# EAGLE schematic 6502_nes_book (EAGLE 6.4), part 3 of 5
## Sheet 14 of 29
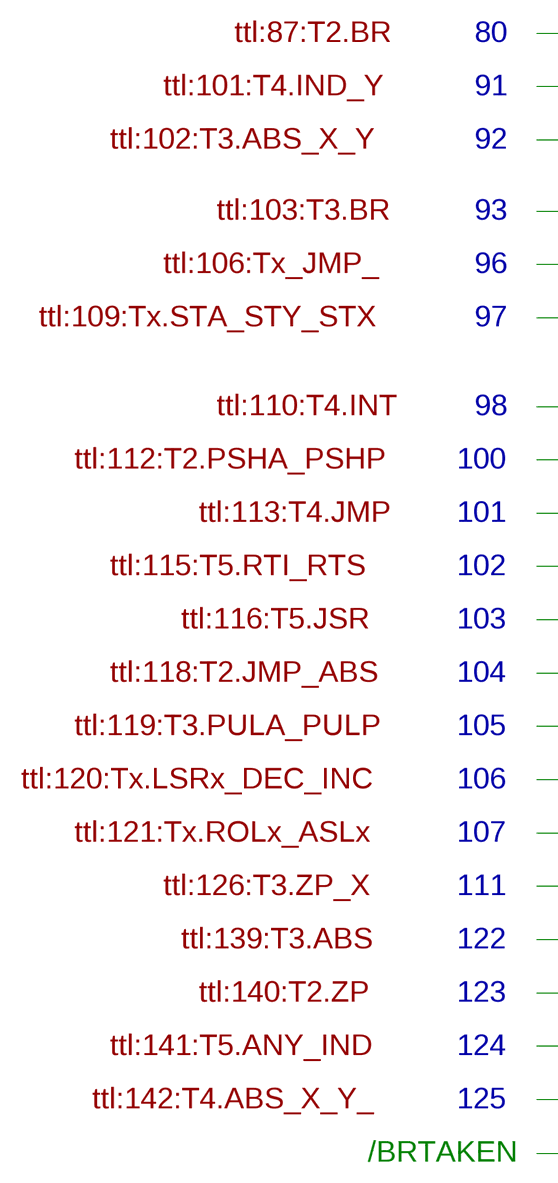
[diagram p15: schematic, sheet 14, part 1 of 3]
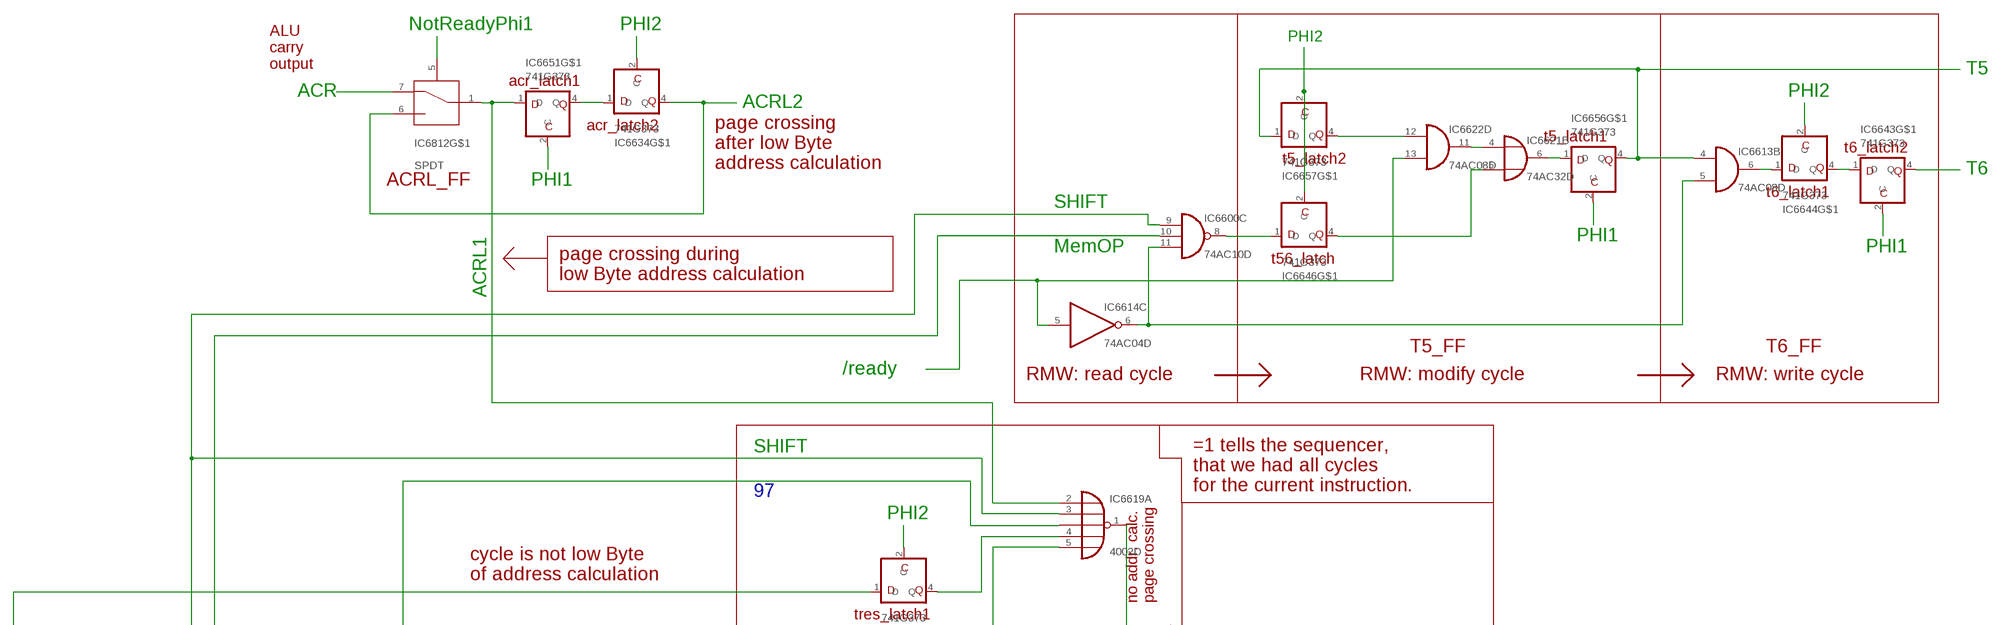
[diagram p16: schematic, sheet 14, part 2 of 3]
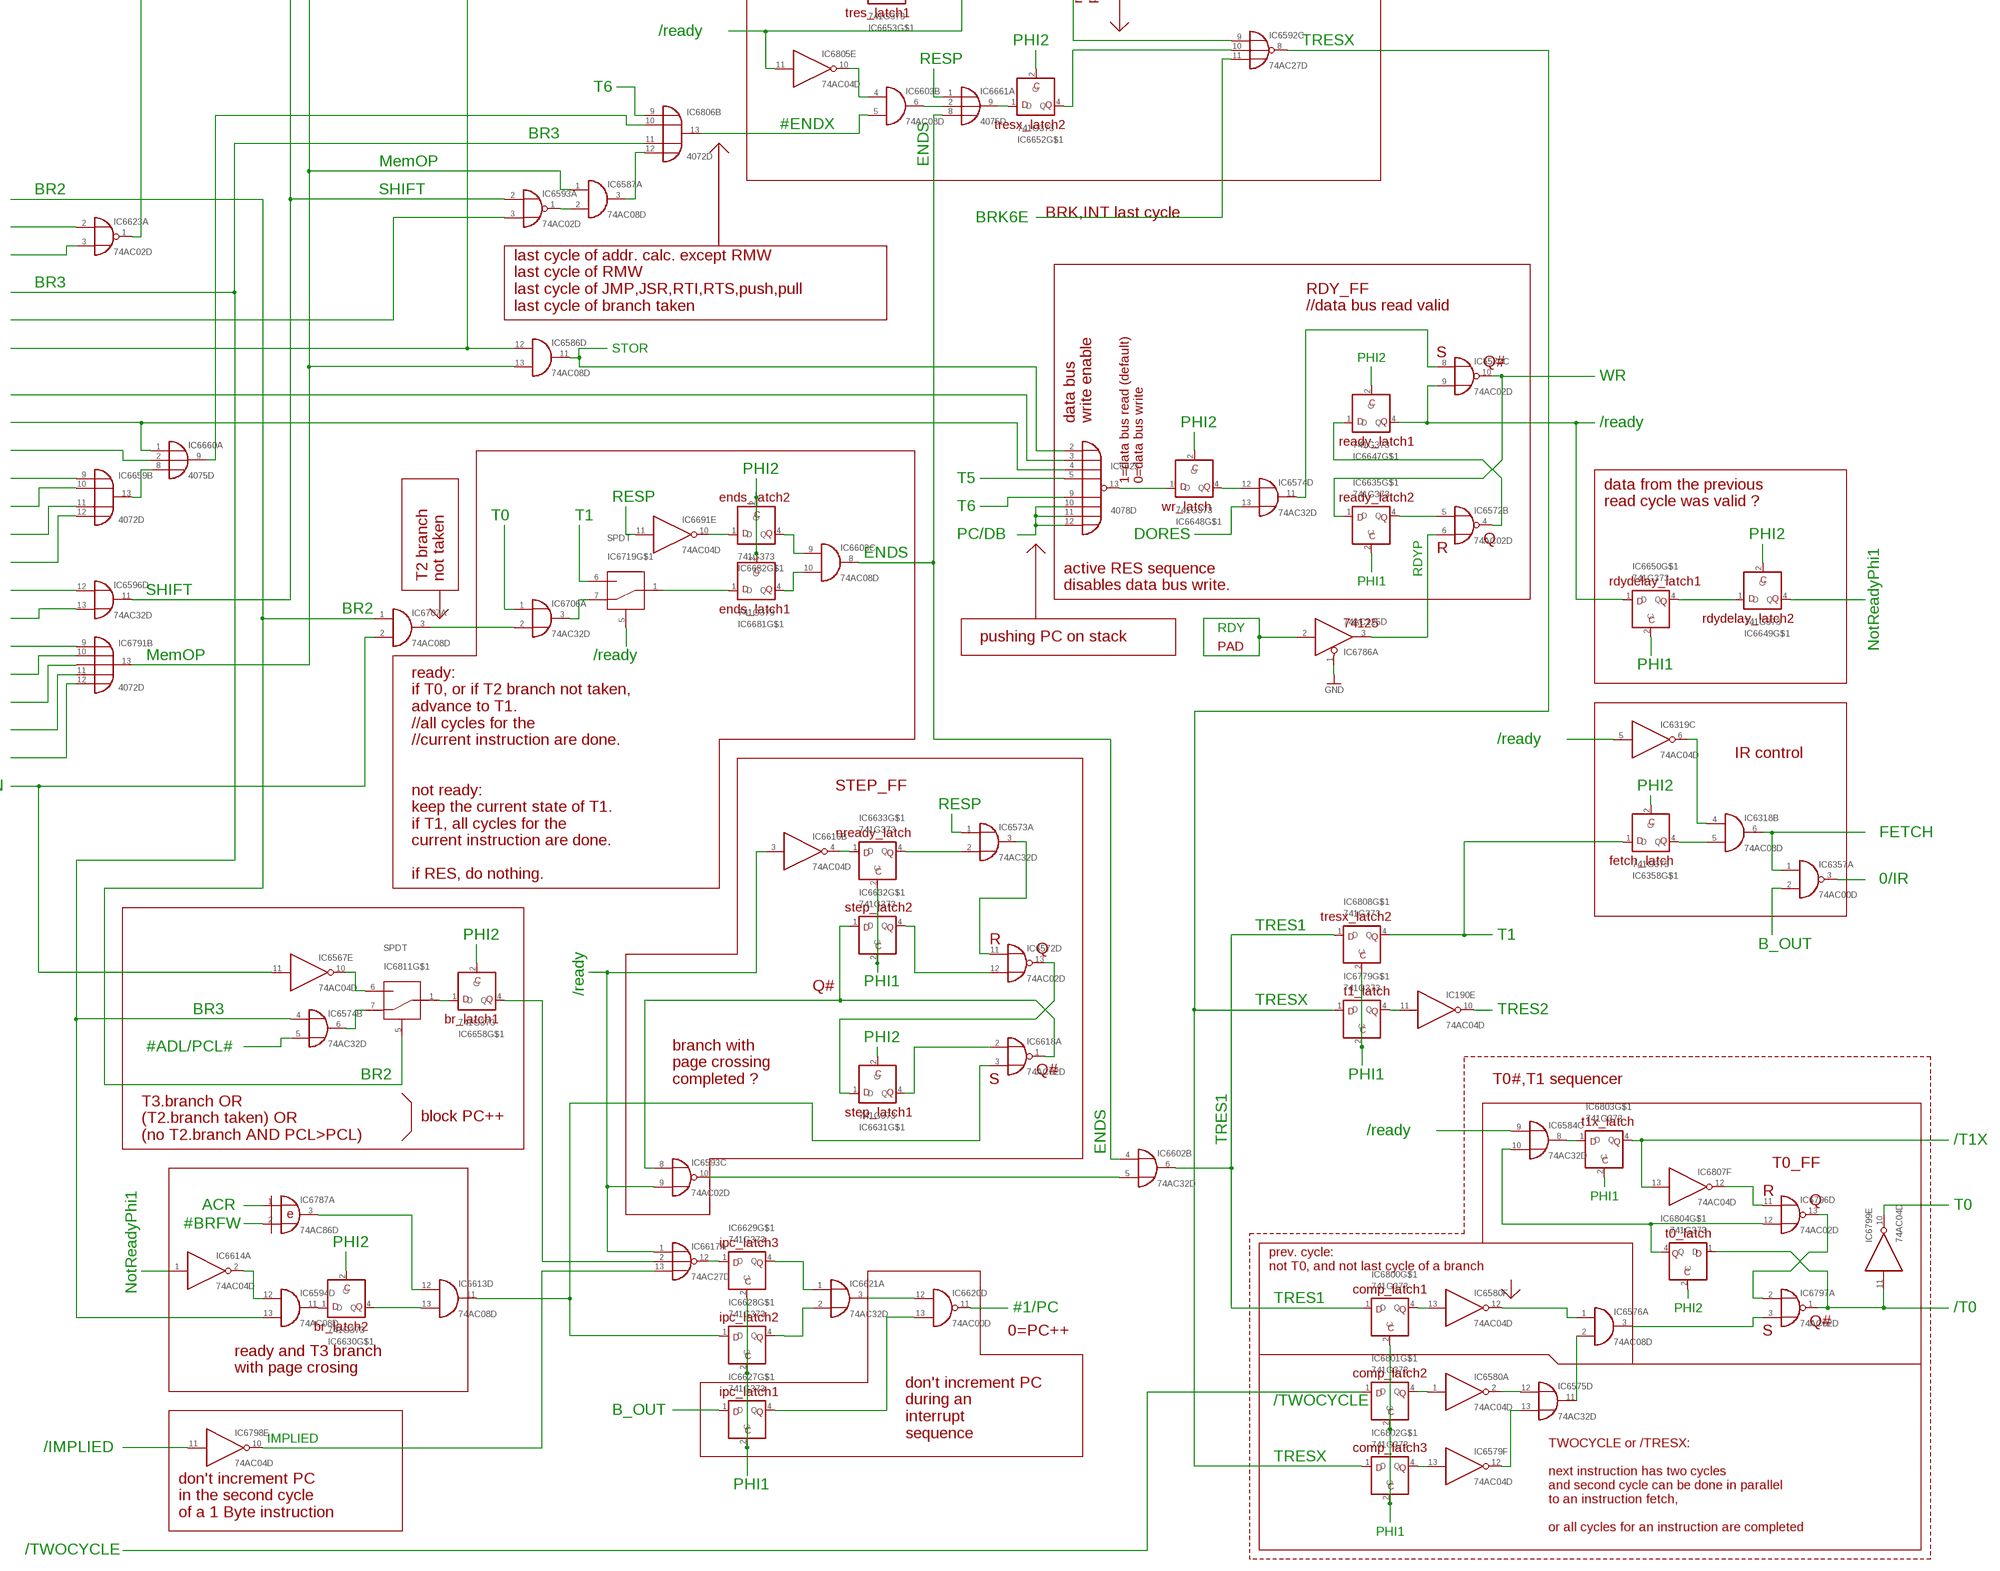
[diagram p17: schematic, sheet 14, part 3 of 3]

### Parts
IC190  74AC04D  [SO14]
IC6318  74AC08D  [SO14]
IC6319  74AC04D  [SO14]
IC6357  74AC00D  [SO14]
IC6358  741G373  [DBV-R-PDSO-G5]
IC6567  74AC04D  [SO14]
IC6572  74AC02D  [SO14]
IC6573  74AC32D  [SO14]
IC6574  74AC32D  [SO14]
IC6575  74AC32D  [SO14]
IC6576  74AC08D  [SO14]
IC6579  74AC04D  [SO14]
IC6580  74AC04D  [SO14]
IC6584  74AC32D  [SO14]
IC6586  74AC08D  [SO14]
IC6587  74AC08D  [SO14]
IC6592  74AC27D  [SO14]
IC6593  74AC02D  [SO14]
IC6594  74AC08D  [SO14]
IC6596  74AC32D  [SO14]
IC6600  74AC10D  [SO14]
IC6602  74AC32D  [SO14]
IC6603  74AC08D  [SO14]
IC6613  74AC08D  [SO14]
IC6614  74AC04D  [SO14]
IC6616  74AC04D  [SO14]
IC6617  74AC27D  [SO14]
IC6618  74AC02D  [SO14]
IC6619  4002D  [SO14]
IC6620  74AC00D  [SO14]
IC6621  74AC32D  [SO14]
IC6622  74AC08D  [SO14]
IC6623  74AC02D  [SO14]
IC6625  4078D  [SO14]
IC6627  741G373  [DBV-R-PDSO-G5]
IC6628  741G373  [DBV-R-PDSO-G5]
IC6629  741G373  [DBV-R-PDSO-G5]
IC6630  741G373  [DBV-R-PDSO-G5]
IC6631  741G373  [DBV-R-PDSO-G5]
IC6632  741G373  [DBV-R-PDSO-G5]
IC6633  741G373  [DBV-R-PDSO-G5]
IC6634  741G373  [DBV-R-PDSO-G5]
IC6635  741G373  [DBV-R-PDSO-G5]
IC6643  741G373  [DBV-R-PDSO-G5]
IC6644  741G373  [DBV-R-PDSO-G5]
IC6646  741G373  [DBV-R-PDSO-G5]
IC6647  741G373  [DBV-R-PDSO-G5]
IC6648  741G373  [DBV-R-PDSO-G5]
IC6649  741G373  [DBV-R-PDSO-G5]
IC6650  741G373  [DBV-R-PDSO-G5]
IC6651  741G373  [DBV-R-PDSO-G5]
IC6652  741G373  [DBV-R-PDSO-G5]
IC6653  741G373  [DBV-R-PDSO-G5]
IC6656  741G373  [DBV-R-PDSO-G5]
IC6657  741G373  [DBV-R-PDSO-G5]
IC6658  741G373  [DBV-R-PDSO-G5]
IC6659  4072D  [SO14]
IC6660  4075D  [SO14]
IC6661  4075D  [SO14]
IC6681  741G373  [DBV-R-PDSO-G5]
IC6682  741G373  [DBV-R-PDSO-G5]
IC6691  74AC04D  [SO14]
IC6706  74AC32D  [SO14]
IC6707  74AC08D  [SO14]
IC6719  SPDT  [SO8]
IC6779  741G373  [DBV-R-PDSO-G5]
IC6786  74AC125D  [SO14]
IC6787  74AC86D  [SO14]
IC6791  4072D  [SO14]
IC6796  74AC02D  [SO14]
IC6797  74AC02D  [SO14]
IC6798  74AC04D  [SO14]
IC6799  74AC04D  [SO14]
IC6800  741G373  [DBV-R-PDSO-G5]
IC6801  741G373  [DBV-R-PDSO-G5]
IC6802  741G373  [DBV-R-PDSO-G5]
IC6803  741G373  [DBV-R-PDSO-G5]
IC6804  741G373  [DBV-R-PDSO-G5]
IC6805  74AC04D  [SO14]
IC6806  4072D  [SO14]
IC6807  74AC04D  [SO14]
IC6808  741G373  [DBV-R-PDSO-G5]
IC6811  SPDT  [SO8]
IC6812  SPDT  [SO8]

### Nets
FEO10: IC6653.2(C)
GND: IC6786.1(A:OE) ; also sheet 1,2,3,4,9,10,11,12,13,19,20,21,22,23
N$2: IC6625.10(I5) IC6625.11(I6) IC6625.12(I7)
N$4: IC6602.6(B:O) IC6800.1(D) IC6808.1(D)
N$26: IC6592.11(C:I2)
N$280: IC6574.4(B:I0) IC6594.13(D:I1) IC6806.11(B:I2)
N$281: IC6574.5(B:I1)
N$348: IC6593.2(A:I0) IC6596.11(D:O) IC6600.9(C:I0) IC6619.3(A:I1)
N$349: IC6649.4(Q)
N$350: IC6806.9(B:I0)
N$351: IC6586.13(D:I1) IC6587.1(A:I0) IC6600.10(C:I1) IC6791.13(B:O)
N$352: IC6613.4(B:I0) IC6656.4(Q) IC6657.1(D)
N$353: IC6643.4(Q)
N$354: IC6812.5(A)
N$355: IC6594.12(D:I0) IC6614.2(A:O)
N$356: IC6658.2(C)
N$357: IC6801.1(D)
N$358: IC190.10(E:O)
N$359: IC6798.11(E:I)
N$11506: IC6357.3(A:O)
N$11508: IC6318.6(B:O) IC6357.1(A:I0)
N$11510: IC6358.2(C)
N$11512: IC6318.4(B:I0) IC6319.6(C:O)
N$11513: IC6357.2(A:I1)
N$11582: IC6319.5(C:I)
N$11583: IC6318.5(B:I1) IC6358.4(Q)
N$11901: IC6572.10(C:O) IC6635.1(D)
N$11903: IC6572.6(B:I1) IC6786.3(A:O)
N$11911: IC6623.2(A:I0)
N$11914: IC6593.3(A:I1)
N$11915: IC6625.3(I1)
N$11917: IC6625.4(I2) IC6660.1(A:I0)
N$11918: IC6660.2(A:I1)
N$11919: IC6596.13(D:I1)
N$11921: IC6791.12(B:I3)
N$11930: IC6791.11(B:I2)
N$11932: IC6791.10(B:I1)
N$11933: IC6791.9(B:I0)
N$11943: IC6660.9(A:O) IC6806.10(B:I1)
N$11944: IC6586.12(D:I0)
N$11945: IC6623.1(A:O) IC6653.1(D)
N$11946: IC6661.1(A:I0)
N$11947: IC6652.2(C)
N$11948: IC6652.1(D) IC6661.9(A:O)
N$11949: IC6592.10(C:I1) IC6652.4(Q)
N$11950: IC6603.5(B:I1) IC6806.13(B:O)
N$11951: IC6587.3(A:O) IC6806.12(B:I3)
N$11952: IC6600.8(C:O) IC6646.1(D)
N$11953: IC6643.2(C)
N$11954: IC6643.1(D) IC6644.4(Q)
N$11955: IC6646.2(C) IC6657.2(C)
N$11956: IC6613.6(B:O) IC6644.1(D)
N$11957: IC6619.4(A:I2) IC6653.4(Q)
N$11959: IC6592.9(C:I0) IC6619.1(A:O)
N$11960: IC6619.5(A:I3) IC6805.11(E:I)
N$11961: IC6603.6(B:O) IC6661.2(A:I1)
N$11962: IC6603.4(B:I0) IC6805.10(E:O)
N$11963: IC6602.4(B:I0) IC6603.8(C:O) IC6661.8(A:I2)
N$11964: IC6650.2(C)
N$11965: IC6649.1(D) IC6650.4(Q)
N$11966: IC6649.2(C)
N$11968: IC6619.2(A:I0) IC6651.1(D) IC6812.1(Q)
N$11969: IC6651.2(C)
N$11970: IC6614.1(A:I)
N$11972: IC6658.1(D) IC6811.1(Q)
N$11973: IC6634.4(Q) IC6812.6(NO)
N$11974: IC6634.2(C)
N$11975: IC6634.1(D) IC6651.4(Q)
N$11976: IC6627.2(C) IC6628.2(C) IC6629.2(C)
N$11977: IC6620.13(D:I1) IC6627.4(Q)
N$11978: IC6621.2(A:I1) IC6628.4(Q)
N$11979: IC6621.1(A:I0) IC6629.4(Q)
N$11980: IC6620.11(D:O)
N$11981: IC6627.1(D)
N$11982: IC6613.11(D:O) IC6618.3(A:I1) IC6628.1(D)
N$11983: IC6787.1(A:I0)
N$11984: IC6593.8(C:I0) IC6618.1(A:O) IC6632.1(D)
N$11985: IC6618.2(A:I0) IC6631.4(Q)
N$11986: IC6593.9(C:I1) IC6616.3(B:I) IC6617.1(A:I0)
N$11987: IC6617.2(A:I1) IC6658.4(Q)
N$11988: IC6630.2(C)
N$11989: IC6613.13(D:I1) IC6630.4(Q)
N$11990: IC6594.11(D:O) IC6630.1(D)
N$11992: IC6593.10(C:O) IC6602.5(B:I1)
N$11993: IC6631.2(C)
N$11994: IC6572.12(D:I1) IC6632.4(Q)
N$11996: IC6616.4(B:O) IC6633.1(D)
N$11998: IC6635.2(C)
N$11999: IC6572.5(B:I0) IC6635.4(Q)
N$12000: IC6572.4(B:O) IC6647.1(D)
N$12001: IC6647.2(C)
N$12006: IC6625.9(I4)
N$12007: IC6648.2(C)
N$12019: IC6600.11(C:I2) IC6613.5(B:I1) IC6614.6(C:O)
N$12020: IC6621.5(B:I1) IC6646.4(Q)
N$12022: IC6614.5(C:I) IC6622.13(D:I1)
N$12023: IC6621.6(B:O) IC6656.1(D)
N$12024: IC6622.12(D:I0) IC6657.4(Q)
N$12025: IC6656.2(C)
N$12028: IC6617.12(A:O) IC6629.1(D)
N$12029: IC6620.12(D:I0) IC6621.3(A:O)
N$12032: IC6621.4(B:I0) IC6622.11(D:O)
N$12033: IC6625.13(J) IC6648.1(D)
N$12035: IC6613.12(D:I0) IC6787.3(A:O)
N$12036: IC6787.2(A:I1)
N$12044: IC6572.9(C:I1) IC6647.4(Q) IC6650.1(D)
N$12070: IC6682.1(D) IC6691.10(E:O)
N$12071: IC6603.9(C:I0) IC6682.4(Q)
N$12072: IC6603.10(C:I1) IC6681.4(Q)
N$12073: IC6681.2(C) IC6682.2(C)
N$12132: IC6625.5(I3)
N$12146: IC6719.6(NO)
N$12147: IC6706.1(A:I0)
N$12148: IC6567.11(E:I) IC6707.2(A:I1)
N$12175: IC6706.3(A:O) IC6719.7(NC)
N$12176: IC6706.2(A:I1) IC6707.3(A:O)
N$12177: IC6719.5(A)
N$12308: IC6779.2(C) IC6808.2(C)
N$12309: IC190.11(E:I) IC6779.4(Q)
N$12318: IC6572.13(D:O) IC6631.1(D)
N$12319: IC6786.2(A:I)
N$12328: IC6812.7(NC)
N$12335: IC6587.2(A:I1) IC6593.1(A:O)
N$12336: IC6623.3(A:I1)
N$12343: IC6586.11(D:O) IC6625.2(I0)
N$12347: IC6596.12(D:I0)
N$12358: IC6574.13(D:I1)
N$12364: IC6659.9(B:I0)
N$12365: IC6659.10(B:I1)
N$12366: IC6659.11(B:I2)
N$12367: IC6659.13(B:O) IC6660.8(A:I2)
N$12370: IC6659.12(B:I3)
N$12374: IC6644.2(C)
N$12377: IC6707.1(A:I0) IC6811.5(A)
N$12380: IC6803.2(C)
N$12381: IC6803.4(Q) IC6807.13(F:I)
N$12382: IC6584.8(C:O) IC6803.1(D)
N$12383: IC6584.9(C:I0)
N$12384: IC6584.10(C:I1) IC6796.12(D:I1) IC6804.4(Q)
N$12385: IC6796.13(D:O) IC6797.2(A:I0)
N$12386: IC6797.1(A:O) IC6799.11(E:I) IC6804.1(D)
N$12387: IC6576.3(A:O) IC6797.3(A:I1)
N$12388: IC6799.10(E:O)
N$12389: IC6804.2(C)
N$12390: IC6617.13(A:I2) IC6798.10(E:O)
N$12391: IC6575.13(D:I1) IC6579.12(F:O)
N$12392: IC6592.8(C:O) IC6779.1(D) IC6802.1(D)
N$12393: IC6575.12(D:I0) IC6580.2(A:O)
N$12394: IC6800.2(C) IC6801.2(C) IC6802.2(C)
N$12395: IC6576.1(A:I0) IC6580.12(F:O)
N$12400: IC6691.11(E:I)
N$12401: IC6681.1(D) IC6719.1(Q)
N$12408: IC6579.13(F:I) IC6802.4(Q)
N$12409: IC6580.1(A:I) IC6801.4(Q)
N$12410: IC6575.11(D:O) IC6576.2(A:I1)
N$12411: IC6580.13(F:I) IC6800.4(Q)
N$12412: IC6796.11(D:I0) IC6807.12(F:O)
N$12413: IC6358.1(D) IC6808.4(Q)
N$12417: IC6567.10(E:O) IC6811.6(NO)
N$12418: IC6574.6(B:O) IC6811.7(NC)
N$12419: IC6574.12(D:I0) IC6648.4(Q)
N$12420: IC6572.8(C:I0) IC6574.11(D:O)
N$12421: IC6572.11(D:I0) IC6573.3(A:O)
N$12422: IC6573.2(A:I1) IC6633.4(Q)
N$12423: IC6573.1(A:I0)
N$12424: IC6632.2(C) IC6633.2(C)
Unconnected: IC190.1(A:I) IC190.2(A:O) IC190.3(B:I) IC190.4(B:O) IC190.5(C:I) IC190.6(C:O) IC190.8(D:O) IC190.9(D:I) IC190.12(F:O) IC190.13(F:I) IC6318.1(A:I0) IC6318.2(A:I1) IC6318.3(A:O) IC6318.8(C:O) IC6318.9(C:I0) IC6318.10(C:I1) IC6318.11(D:O) IC6318.12(D:I0) IC6318.13(D:I1) IC6319.1(A:I) IC6319.2(A:O) IC6319.3(B:I) IC6319.4(B:O) IC6319.8(D:O) IC6319.9(D:I) IC6319.10(E:O) IC6319.11(E:I) IC6319.12(F:O) IC6319.13(F:I) IC6357.4(B:I0) IC6357.5(B:I1) IC6357.6(B:O) IC6357.8(C:O) IC6357.9(C:I0) IC6357.10(C:I1) IC6357.11(D:O) IC6357.12(D:I0) IC6357.13(D:I1) IC6567.1(A:I) IC6567.2(A:O) IC6567.3(B:I) IC6567.4(B:O) IC6567.5(C:I) IC6567.6(C:O) IC6567.8(D:O) IC6567.9(D:I) IC6567.12(F:O) IC6567.13(F:I) IC6572.1(A:O) IC6572.2(A:I0) IC6572.3(A:I1) IC6573.4(B:I0) IC6573.5(B:I1) IC6573.6(B:O) IC6573.8(C:O) IC6573.9(C:I0) IC6573.10(C:I1) IC6573.11(D:O) IC6573.12(D:I0) IC6573.13(D:I1) IC6574.1(A:I0) IC6574.2(A:I1) IC6574.3(A:O) IC6574.8(C:O) IC6574.9(C:I0) IC6574.10(C:I1) IC6575.1(A:I0) IC6575.2(A:I1) IC6575.3(A:O) IC6575.4(B:I0) IC6575.5(B:I1) IC6575.6(B:O) IC6575.8(C:O) IC6575.9(C:I0) IC6575.10(C:I1) IC6576.4(B:I0) IC6576.5(B:I1) IC6576.6(B:O) IC6576.8(C:O) IC6576.9(C:I0) IC6576.10(C:I1) IC6576.11(D:O) IC6576.12(D:I0) IC6576.13(D:I1) IC6579.1(A:I) IC6579.2(A:O) IC6579.3(B:I) IC6579.4(B:O) IC6579.5(C:I) IC6579.6(C:O) IC6579.8(D:O) IC6579.9(D:I) IC6579.10(E:O) IC6579.11(E:I) IC6580.3(B:I) IC6580.4(B:O) IC6580.5(C:I) IC6580.6(C:O) IC6580.8(D:O) IC6580.9(D:I) IC6580.10(E:O) IC6580.11(E:I) IC6584.1(A:I0) IC6584.2(A:I1) IC6584.3(A:O) IC6584.4(B:I0) IC6584.5(B:I1) IC6584.6(B:O) IC6584.11(D:O) IC6584.12(D:I0) IC6584.13(D:I1) IC6586.1(A:I0) IC6586.2(A:I1) IC6586.3(A:O) IC6586.4(B:I0) IC6586.5(B:I1) IC6586.6(B:O) IC6586.8(C:O) IC6586.9(C:I0) IC6586.10(C:I1) IC6587.4(B:I0) IC6587.5(B:I1) IC6587.6(B:O) IC6587.8(C:O) IC6587.9(C:I0) IC6587.10(C:I1) IC6587.11(D:O) IC6587.12(D:I0) IC6587.13(D:I1) IC6592.1(A:I0) IC6592.2(A:I1) IC6592.3(B:I0) IC6592.4(B:I1) IC6592.5(B:I2) IC6592.6(B:O) IC6592.12(A:O) IC6592.13(A:I2) IC6593.4(B:O) IC6593.5(B:I0) IC6593.6(B:I1) IC6593.11(D:I0) IC6593.12(D:I1) IC6593.13(D:O) IC6594.1(A:I0) IC6594.2(A:I1) IC6594.3(A:O) IC6594.4(B:I0) IC6594.5(B:I1) IC6594.6(B:O) IC6594.8(C:O) IC6594.9(C:I0) IC6594.10(C:I1) IC6596.1(A:I0) IC6596.2(A:I1) IC6596.3(A:O) IC6596.4(B:I0) IC6596.5(B:I1) IC6596.6(B:O) IC6596.8(C:O) IC6596.9(C:I0) IC6596.10(C:I1) IC6600.1(A:I0) IC6600.2(A:I1) IC6600.3(B:I0) IC6600.4(B:I1) IC6600.5(B:I2) IC6600.6(B:O) IC6600.12(A:O) IC6600.13(A:I2) IC6602.1(A:I0) IC6602.2(A:I1) IC6602.3(A:O) IC6602.8(C:O) IC6602.9(C:I0) IC6602.10(C:I1) IC6602.11(D:O) IC6602.12(D:I0) IC6602.13(D:I1) IC6603.1(A:I0) IC6603.2(A:I1) IC6603.3(A:O) IC6603.11(D:O) IC6603.12(D:I0) IC6603.13(D:I1) IC6613.1(A:I0) IC6613.2(A:I1) IC6613.3(A:O) IC6613.8(C:O) IC6613.9(C:I0) IC6613.10(C:I1) IC6614.3(B:I) IC6614.4(B:O) IC6614.8(D:O) IC6614.9(D:I) IC6614.10(E:O) IC6614.11(E:I) IC6614.12(F:O) IC6614.13(F:I) IC6616.1(A:I) IC6616.2(A:O) IC6616.5(C:I) IC6616.6(C:O) IC6616.8(D:O) IC6616.9(D:I) IC6616.10(E:O) IC6616.11(E:I) IC6616.12(F:O) IC6616.13(F:I) IC6617.3(B:I0) IC6617.4(B:I1) IC6617.5(B:I2) IC6617.6(B:O) IC6617.8(C:O) IC6617.9(C:I0) IC6617.10(C:I1) IC6617.11(C:I2) IC6618.4(B:O) IC6618.5(B:I0) IC6618.6(B:I1) IC6618.8(C:I0) IC6618.9(C:I1) IC6618.10(C:O) IC6618.11(D:I0) IC6618.12(D:I1) IC6618.13(D:O) IC6619.9(B:I0) IC6619.10(B:I1) IC6619.11(B:I2) IC6619.12(B:I3) IC6619.13(B:O) IC6620.1(A:I0) IC6620.2(A:I1) IC6620.3(A:O) IC6620.4(B:I0) IC6620.5(B:I1) IC6620.6(B:O) IC6620.8(C:O) IC6620.9(C:I0) IC6620.10(C:I1) IC6621.8(C:O) IC6621.9(C:I0) IC6621.10(C:I1) IC6621.11(D:O) IC6621.12(D:I0) IC6621.13(D:I1) IC6622.1(A:I0) IC6622.2(A:I1) IC6622.3(A:O) IC6622.4(B:I0) IC6622.5(B:I1) IC6622.6(B:O) IC6622.8(C:O) IC6622.9(C:I0) IC6622.10(C:I1) IC6623.4(B:O) IC6623.5(B:I0) IC6623.6(B:I1) IC6623.8(C:I0) IC6623.9(C:I1) IC6623.10(C:O) IC6623.11(D:I0) IC6623.12(D:I1) IC6623.13(D:O) IC6659.1(A:O) IC6659.2(A:I0) IC6659.3(A:I1) IC6659.4(A:I2) IC6659.5(A:I3) IC6660.3(B:I0) IC6660.4(B:I1) IC6660.5(B:I2) IC6660.6(B:O) IC6660.10(C:O) IC6660.11(C:I0) IC6660.12(C:I1) IC6660.13(C:I2) IC6661.3(B:I0) IC6661.4(B:I1) IC6661.5(B:I2) IC6661.6(B:O) IC6661.10(C:O) IC6661.11(C:I0) IC6661.12(C:I1) IC6661.13(C:I2) IC6691.1(A:I) IC6691.2(A:O) IC6691.3(B:I) IC6691.4(B:O) IC6691.5(C:I) IC6691.6(C:O) IC6691.8(D:O) IC6691.9(D:I) IC6691.12(F:O) IC6691.13(F:I) IC6706.4(B:I0) IC6706.5(B:I1) IC6706.6(B:O) IC6706.8(C:O) IC6706.9(C:I0) IC6706.10(C:I1) IC6706.11(D:O) IC6706.12(D:I0) IC6706.13(D:I1) IC6707.4(B:I0) IC6707.5(B:I1) IC6707.6(B:O) IC6707.8(C:O) IC6707.9(C:I0) IC6707.10(C:I1) IC6707.11(D:O) IC6707.12(D:I0) IC6707.13(D:I1) IC6786.4(B:OE) IC6786.5(B:I) IC6786.6(B:O) IC6786.8(C:O) IC6786.9(C:I) IC6786.10(C:OE) IC6786.11(D:O) IC6786.12(D:I) IC6786.13(D:OE) IC6787.4(B:I0) IC6787.5(B:I1) IC6787.6(B:O) IC6787.8(C:O) IC6787.9(C:I0) IC6787.10(C:I1) IC6787.11(D:O) IC6787.12(D:I0) IC6787.13(D:I1) IC6791.1(A:O) IC6791.2(A:I0) IC6791.3(A:I1) IC6791.4(A:I2) IC6791.5(A:I3) IC6796.1(A:O) IC6796.2(A:I0) IC6796.3(A:I1) IC6796.4(B:O) IC6796.5(B:I0) IC6796.6(B:I1) IC6796.8(C:I0) IC6796.9(C:I1) IC6796.10(C:O) IC6797.4(B:O) IC6797.5(B:I0) IC6797.6(B:I1) IC6797.8(C:I0) IC6797.9(C:I1) IC6797.10(C:O) IC6797.11(D:I0) IC6797.12(D:I1) IC6797.13(D:O) IC6798.1(A:I) IC6798.2(A:O) IC6798.3(B:I) IC6798.4(B:O) IC6798.5(C:I) IC6798.6(C:O) IC6798.8(D:O) IC6798.9(D:I) IC6798.12(F:O) IC6798.13(F:I) IC6799.1(A:I) IC6799.2(A:O) IC6799.3(B:I) IC6799.4(B:O) IC6799.5(C:I) IC6799.6(C:O) IC6799.8(D:O) IC6799.9(D:I) IC6799.12(F:O) IC6799.13(F:I) IC6805.1(A:I) IC6805.2(A:O) IC6805.3(B:I) IC6805.4(B:O) IC6805.5(C:I) IC6805.6(C:O) IC6805.8(D:O) IC6805.9(D:I) IC6805.12(F:O) IC6805.13(F:I) IC6806.1(A:O) IC6806.2(A:I0) IC6806.3(A:I1) IC6806.4(A:I2) IC6806.5(A:I3) IC6807.1(A:I) IC6807.2(A:O) IC6807.3(B:I) IC6807.4(B:O) IC6807.5(C:I) IC6807.6(C:O) IC6807.8(D:O) IC6807.9(D:I) IC6807.10(E:O) IC6807.11(E:I)

### Notes on the sheet
- NotReadyPhi1 | PHI2
- PHI2
- ALU
  carry
  output
- T5
- acr_latch1
- ACR | PHI2
- ACRL2
- acr_latch2
- t5_latch1
- t6_latch2
- t5_latch2
- page crossing
  after low Byte
  address calculation
- T6
- ACRL_FF | PHI1
- t6_latch1
- SHIFT
- PHI1
- MemOP | PHI1
- t56_latch
- page crossing during
  low Byte address calculation
- ACRL1
- T5_FF | T6_FF
- /ready
- RMW: read cycle | RMW: modify cycle | RMW: write cycle
- SHIFT
- =1 tells the sequencer,
  that we had all cycles 
  for the current instruction.
- 97
- PHI2
- cycle is not low Byte 
  of address calculation
- no addr. calc.
  page crossing
- tres_latch1
- /ready
- PHI2 | TRESX
- RESP
- T6
- #ENDX | tresx_latch2
- BR3
- MemOP | ENDS
- BR2 | SHIFT
- ttl:87:T2.BR | 80
- BRK,INT last cycle
- BRK6E
- ttl:101:T4.IND_Y | 91
- ttl:102:T3.ABS_X_Y | 92
- BR3
- ttl:103:T3.BR | 93
- last cycle of addr. calc. except RMW
  last cycle of RMW
  last cycle of JMP,JSR,RTI,RTS,push,pull
  last cycle of branch taken
- RDY_FF
  //data bus read valid
- ttl:106:Tx_JMP_ | 96
- ttl:109:Tx.STA_STY_STX | 97 | STOR
- S
- PHI2
- Q#
- WR
- ttl:110:T4.INT | 98
- data bus
  write enable
- ttl:112:T2.PSHA_PSHP | 100 | PHI2 | /ready
- ready_latch1
- ttl:113:T4.JMP | 101
- PHI2
- ttl:115:T5.RTI_RTS | 102 | T5
- 1=data bus read (default)
  0=data bus write
- RESP | ends_latch2 | ready_latch2
- data from the previous
  read cycle was valid ?
- ttl:116:T5.JSR | 103 | T6 | wr_latch
- T0 | T1
- ttl:118:T2.JMP_ABS | 104 | PC/DB | DORES | PHI2
- Q
- R
- ENDS
- ttl:119:T3.PULA_PULP | 105
- RDYP
- T2 branch 
  not taken
- PHI1 | rdydelay_latch1
- active RES sequence 
  disables data bus write.
- ttl:120:Tx.LSRx_DEC_INC | 106 | SHIFT
- BR2 | ends_latch1
- ttl:121:Tx.ROLx_ASLx | 107 | rdydelay_latch2
- 74125
- RDY
- pushing PC on stack
- ttl:126:T3.ZP_X | 111 | PAD | NotReadyPhi1
- MemOP | /ready
- PHI1
- ttl:139:T3.ABS | 122
- ttl:140:T2.ZP | 123
- ttl:141:T5.ANY_IND | 124
- /ready
- IR control
- ttl:142:T4.ABS_X_Y_ | 125
- /BRTAKEN | STEP_FF | PHI2
- RESP
- nready_latch | FETCH
- fetch_latch
- ready: 
  if T0, or if T2 branch not taken,
  advance to T1.
  //all cycles for the 
  //current instruction are done.
  
  
  not ready:
  keep the current state of T1.
  if T1, all cycles for the 
  current instruction are done.
  
  if RES, do nothing.
- 0/IR
- step_latch2
- tresx_latch2
- TRES1
- PHI2 | T1
- R
- B_OUT
- Q
- PHI1
- Q#
- /ready | t1_latch
- TRESX
- BR3 | TRES2
- br_latch1
- PHI2
- #ADL/PCL#
- Q#
- BR2 | PHI1
- branch with 
  page crossing 
  completed ?
- S | T0#,T1 sequencer
- step_latch1
- block PC++
- t1x_latch
- /ready
- T3.branch OR
  (T2.branch taken) OR
  (no T2.branch AND PCL>PCL)
- TRES1 | /T1X
- ENDS
- T0_FF
- R
- PHI1
- Q
- ACR | T0
- #BRFW
- t0_latch
- PHI2 | ipc_latch3
- prev. cycle:
  not T0, and not last cycle of a branch
- NotReadyPhi1 | comp_latch1
- TRES1
- #1/PC | PHI2 | /T0
- ipc_latch2
- Q#
- br_latch2
- 0=PC++ | S
- ready and T3 branch
  with page crosing
- comp_latch2
- ipc_latch1
- /TWOCYCLE
- B_OUT
- don't increment PC 
  during an
  interrupt
  sequence
- IMPLIED
- /IMPLIED | comp_latch3
- TRESX
- PHI1
- don't increment PC
  in the second cycle
  of a 1 Byte instruction
- TWOCYCLE or /TRESX:
  
  next instruction has two cycles 
  and second cycle can be done in parallel 
  to an instruction fetch,
  
  or all cycles for an instruction are completed
- PHI1
- /TWOCYCLE
- https://github.com/emu-russia/breaks/blob/master/BreakingNESWiki_DeepL/6502/dispatch.md
  13:https://github.com/emu-russia/breaks/blob/master/BreakingNESWiki/imgstore/logisim/dispatcher_logisim.jpg

## Sheet 15 of 29
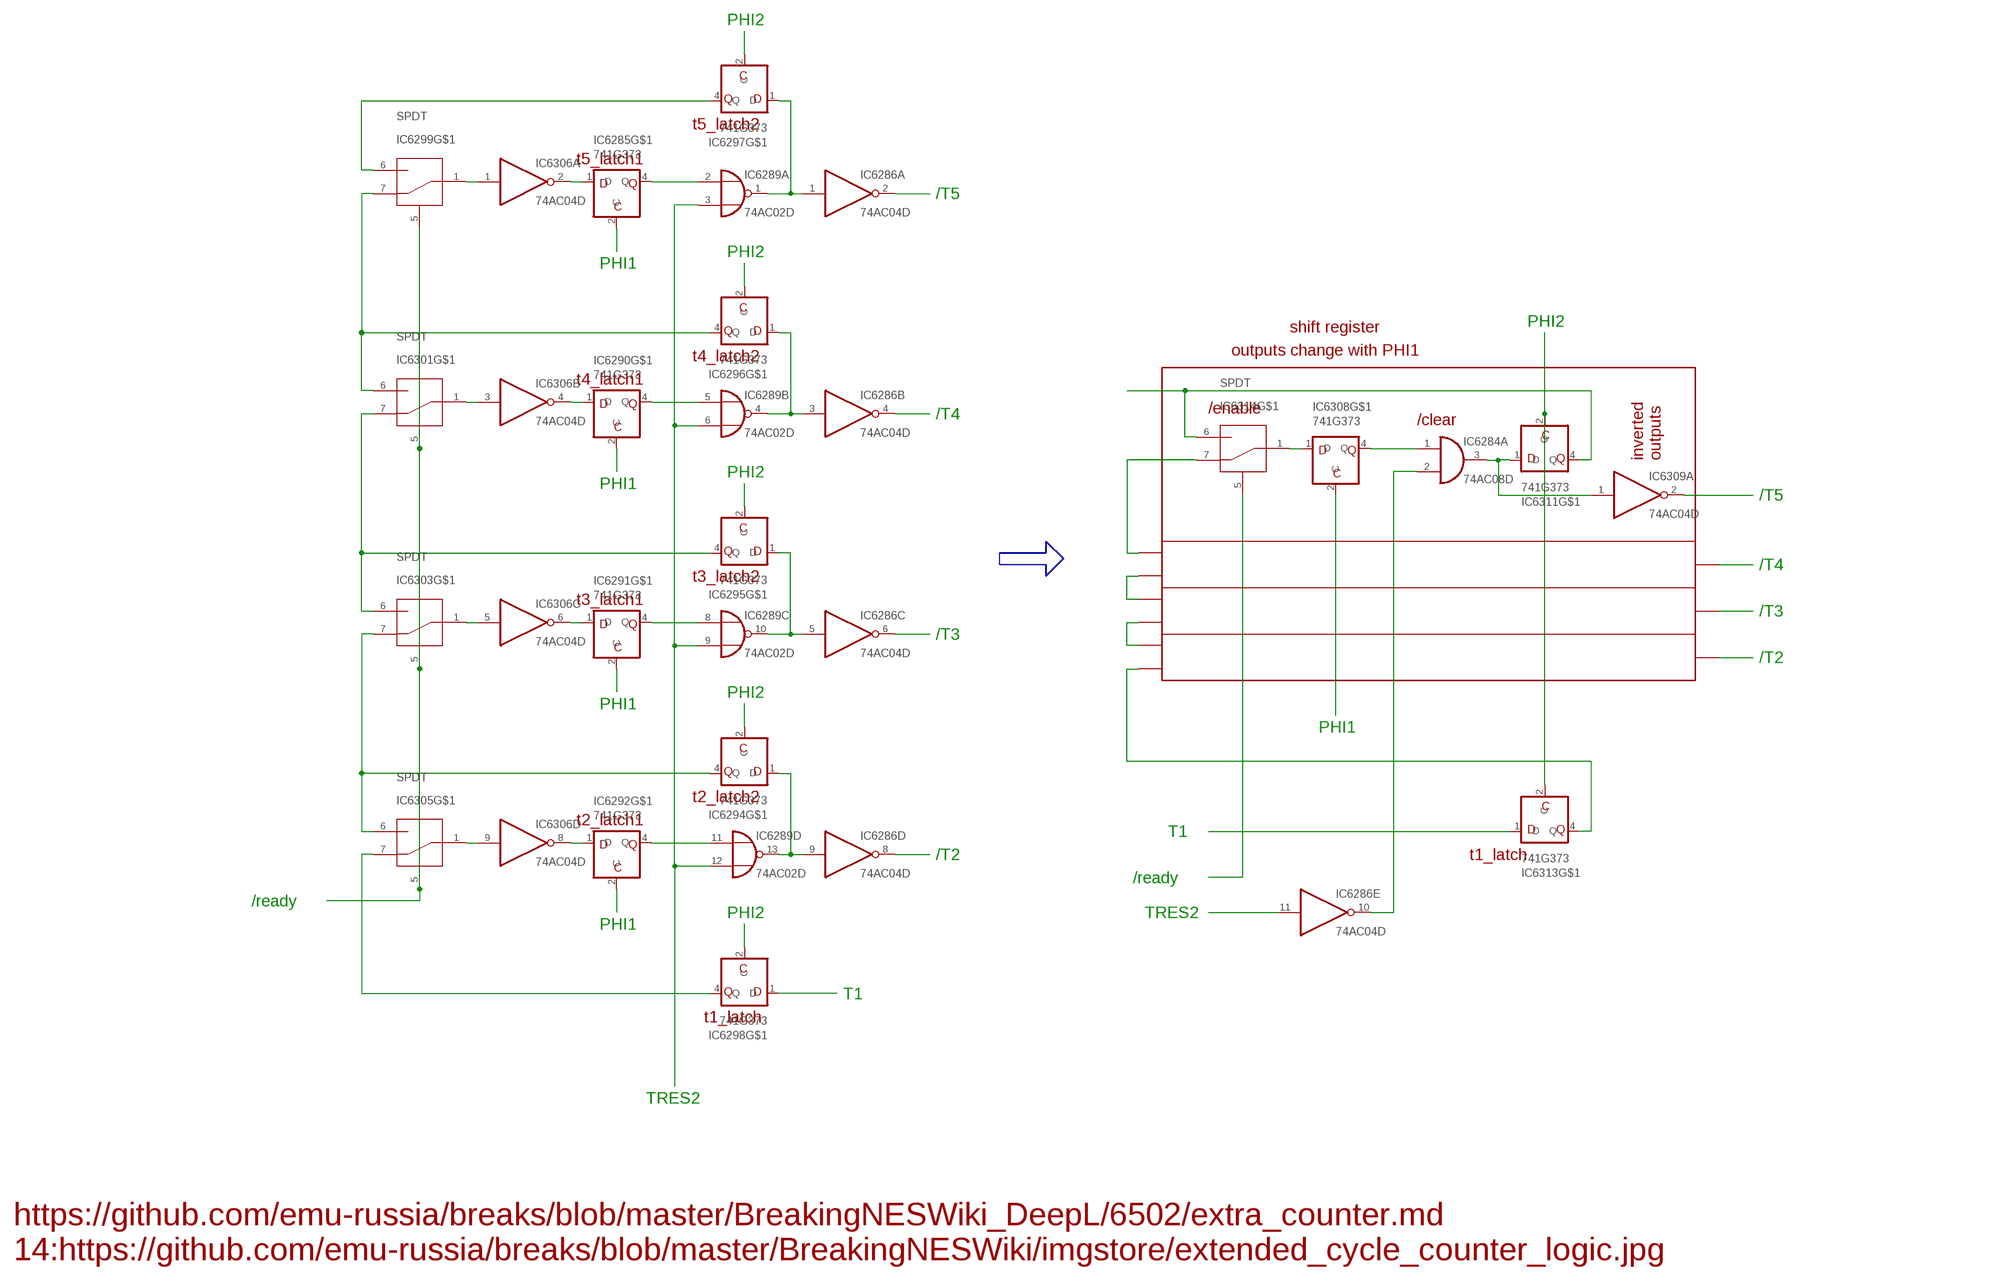
[diagram p18: schematic, sheet 15]

### Parts
IC6284  74AC08D  [SO14]
IC6285  741G373  [DBV-R-PDSO-G5]
IC6286  74AC04D  [SO14]
IC6289  74AC02D  [SO14]
IC6290  741G373  [DBV-R-PDSO-G5]
IC6291  741G373  [DBV-R-PDSO-G5]
IC6292  741G373  [DBV-R-PDSO-G5]
IC6294  741G373  [DBV-R-PDSO-G5]
IC6295  741G373  [DBV-R-PDSO-G5]
IC6296  741G373  [DBV-R-PDSO-G5]
IC6297  741G373  [DBV-R-PDSO-G5]
IC6298  741G373  [DBV-R-PDSO-G5]
IC6299  SPDT  [SO8]
IC6301  SPDT  [SO8]
IC6303  SPDT  [SO8]
IC6305  SPDT  [SO8]
IC6306  74AC04D  [SO14]
IC6308  741G373  [DBV-R-PDSO-G5]
IC6309  74AC04D  [SO14]
IC6311  741G373  [DBV-R-PDSO-G5]
IC6313  741G373  [DBV-R-PDSO-G5]
IC6314  SPDT  [SO8]

### Nets
N$11285: IC6298.1(D)
N$11411: IC6299.5(A) IC6301.5(A) IC6303.5(A) IC6305.5(A)
N$11431: IC6298.2(C)
N$11436: IC6298.4(Q) IC6305.7(NC)
N$11437: IC6294.4(Q) IC6303.7(NC) IC6305.6(NO)
N$11438: IC6292.2(C)
N$11439: IC6292.1(D) IC6306.8(D:O)
N$11440: IC6289.11(D:I0) IC6292.4(Q)
N$11441: IC6286.9(D:I) IC6289.13(D:O) IC6294.1(D)
N$11442: IC6294.2(C)
N$11443: IC6286.5(C:I) IC6289.10(C:O) IC6295.1(D)
N$11444: IC6295.4(Q) IC6301.7(NC) IC6303.6(NO)
N$11445: IC6291.1(D) IC6306.6(C:O)
N$11446: IC6291.2(C)
N$11447: IC6289.8(C:I0) IC6291.4(Q)
N$11448: IC6295.2(C)
N$11452: IC6290.1(D) IC6306.4(B:O)
N$11453: IC6290.2(C)
N$11454: IC6289.5(B:I0) IC6290.4(Q)
N$11455: IC6286.3(B:I) IC6289.4(B:O) IC6296.1(D)
N$11458: IC6296.4(Q) IC6299.7(NC) IC6301.6(NO)
N$11459: IC6296.2(C)
N$11460: IC6285.2(C)
N$11461: IC6285.4(Q) IC6289.2(A:I0)
N$11462: IC6297.4(Q) IC6299.6(NO)
N$11463: IC6297.2(C)
N$11464: IC6286.1(A:I) IC6289.1(A:O) IC6297.1(D)
N$11465: IC6289.3(A:I1) IC6289.6(B:I1) IC6289.9(C:I1) IC6289.12(D:I1)
N$11471: IC6286.8(D:O)
N$11472: IC6286.6(C:O)
N$11473: IC6286.4(B:O)
N$11474: IC6286.2(A:O)
N$11475: IC6285.1(D) IC6306.2(A:O)
N$11476: IC6299.1(Q) IC6306.1(A:I)
N$11477: IC6301.1(Q) IC6306.3(B:I)
N$11480: IC6303.1(Q) IC6306.5(C:I)
N$11481: IC6305.1(Q) IC6306.9(D:I)
N$11482: IC6313.1(D)
N$11484: IC6314.5(A)
N$11486: IC6311.2(C) IC6313.2(C)
N$11487: IC6314.7(NC)
N$11488: IC6284.1(A:I0) IC6308.4(Q)
N$11490: IC6311.4(Q) IC6314.6(NO)
N$11491: IC6284.3(A:O) IC6309.1(A:I) IC6311.1(D)
N$11492: IC6308.2(C)
N$11493: IC6286.11(E:I)
N$11494: IC6284.2(A:I1) IC6286.10(E:O)
N$11495: IC6309.2(A:O)
N$11496: IC6308.1(D) IC6314.1(Q)
N$11500: IC6313.4(Q)
Unconnected: IC6284.4(B:I0) IC6284.5(B:I1) IC6284.6(B:O) IC6284.8(C:O) IC6284.9(C:I0) IC6284.10(C:I1) IC6284.11(D:O) IC6284.12(D:I0) IC6284.13(D:I1) IC6286.12(F:O) IC6286.13(F:I) IC6306.10(E:O) IC6306.11(E:I) IC6306.12(F:O) IC6306.13(F:I) IC6309.3(B:I) IC6309.4(B:O) IC6309.5(C:I) IC6309.6(C:O) IC6309.8(D:O) IC6309.9(D:I) IC6309.10(E:O) IC6309.11(E:I) IC6309.12(F:O) IC6309.13(F:I)

### Buses
B$12

### Notes on the sheet
- PHI2
- t5_latch2
- t5_latch1
- /T5
- PHI2
- PHI1
- PHI2
- shift register
- outputs change with PHI1
- t4_latch2
- t4_latch1
- /enable
- /T4
- /clear
- inverted
  outputs
- PHI2
- PHI1
- /T5
- /T4
- t3_latch2
- t3_latch1
- /T3
- /T3
- /T2
- PHI2
- PHI1
- PHI1
- t2_latch2
- t2_latch1
- T1
- /T2 | t1_latch
- /ready
- /ready
- PHI2 | TRES2
- PHI1
- T1
- t1_latch
- TRES2
- https://github.com/emu-russia/breaks/blob/master/BreakingNESWiki_DeepL/6502/extra_counter.md
  14:https://github.com/emu-russia/breaks/blob/master/BreakingNESWiki/imgstore/extended_cycle_counter_logic.jpg

## Sheet 16 of 29
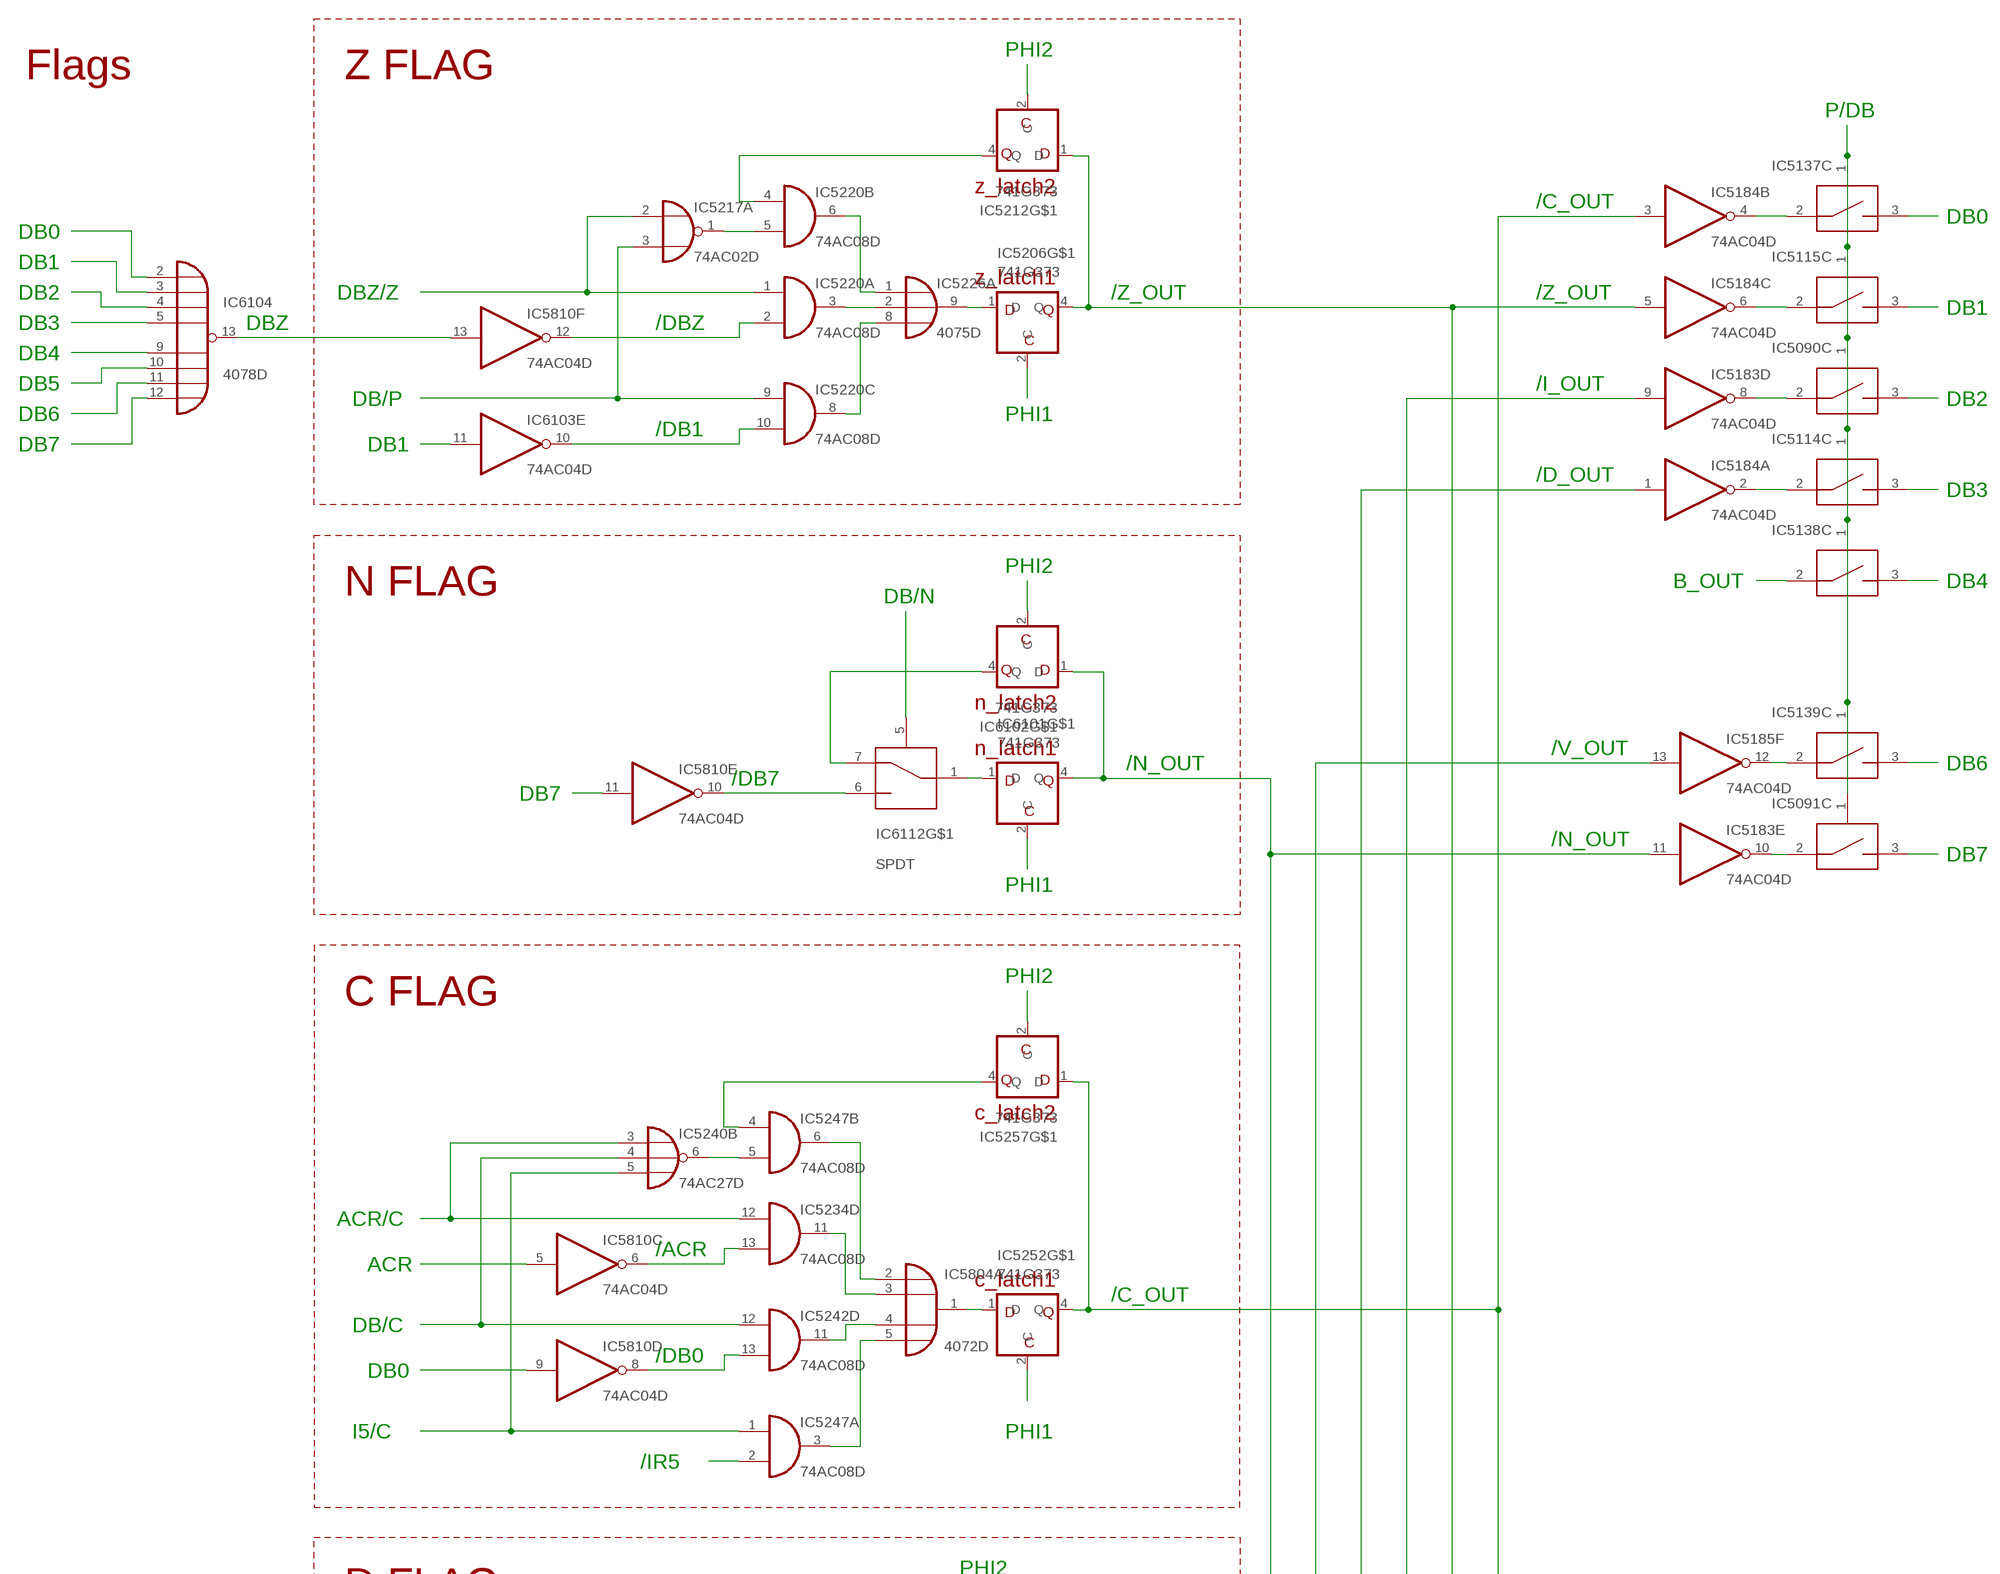
[diagram p19: schematic, sheet 16, part 1 of 2]
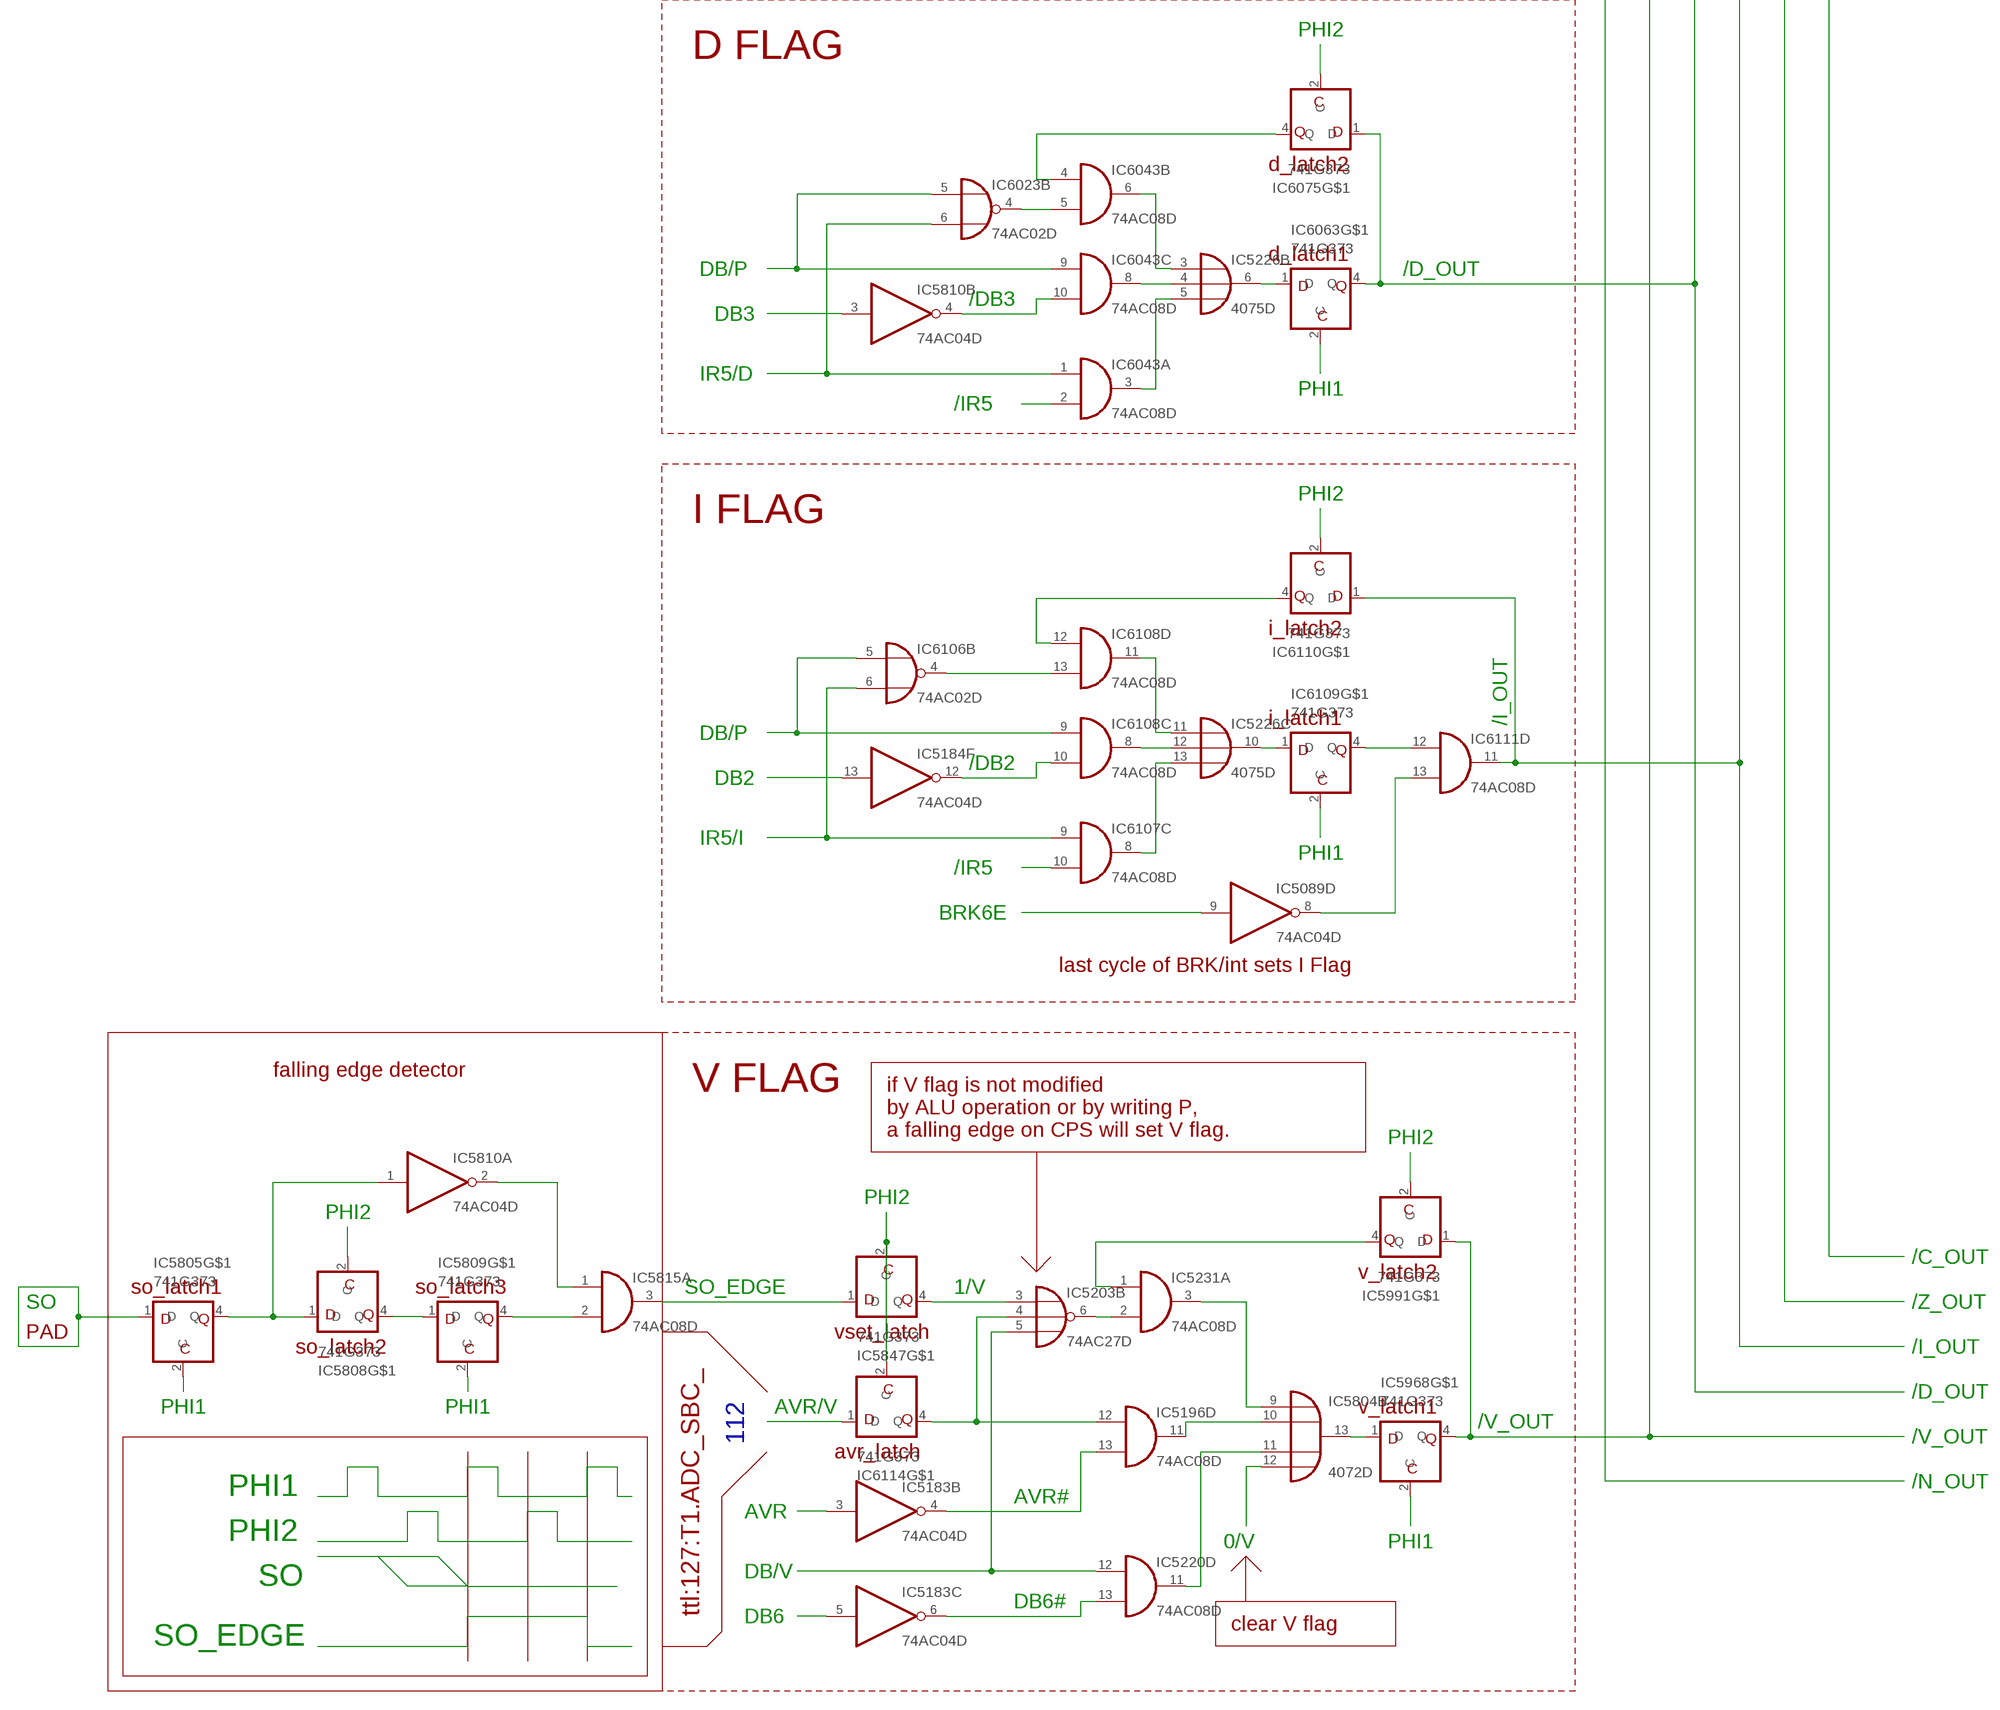
[diagram p20: schematic, sheet 16, part 2 of 2]

### Parts
IC5089  74AC04D  [SO14]
IC5090  MAX4613SO16  [SO16]
IC5091  MAX4613SO16  [SO16]
IC5114  MAX4613SO16  [SO16]
IC5115  MAX4613SO16  [SO16]
IC5137  MAX4613SO16  [SO16]
IC5138  MAX4613SO16  [SO16]
IC5139  MAX4613SO16  [SO16]
IC5183  74AC04D  [SO14]
IC5184  74AC04D  [SO14]
IC5185  74AC04D  [SO14]
IC5196  74AC08D  [SO14]
IC5203  74AC27D  [SO14]
IC5206  741G373  [DBV-R-PDSO-G5]
IC5212  741G373  [DBV-R-PDSO-G5]
IC5217  74AC02D  [SO14]
IC5220  74AC08D  [SO14]
IC5226  4075D  [SO14]
IC5231  74AC08D  [SO14]
IC5234  74AC08D  [SO14]
IC5240  74AC27D  [SO14]
IC5242  74AC08D  [SO14]
IC5247  74AC08D  [SO14]
IC5252  741G373  [DBV-R-PDSO-G5]
IC5257  741G373  [DBV-R-PDSO-G5]
IC5804  4072D  [SO14]
IC5805  741G373  [DBV-R-PDSO-G5]
IC5808  741G373  [DBV-R-PDSO-G5]
IC5809  741G373  [DBV-R-PDSO-G5]
IC5810  74AC04D  [SO14]
IC5815  74AC08D  [SO14]
IC5847  741G373  [DBV-R-PDSO-G5]
IC5968  741G373  [DBV-R-PDSO-G5]
IC5991  741G373  [DBV-R-PDSO-G5]
IC6023  74AC02D  [SO14]
IC6043  74AC08D  [SO14]
IC6063  741G373  [DBV-R-PDSO-G5]
IC6075  741G373  [DBV-R-PDSO-G5]
IC6101  741G373  [DBV-R-PDSO-G5]
IC6102  741G373  [DBV-R-PDSO-G5]
IC6103  74AC04D  [SO14]
IC6104  4078D  [SO14]
IC6106  74AC02D  [SO14]
IC6107  74AC08D  [SO14]
IC6108  74AC08D  [SO14]
IC6109  741G373  [DBV-R-PDSO-G5]
IC6110  741G373  [DBV-R-PDSO-G5]
IC6111  74AC08D  [SO14]
IC6112  SPDT  [SO8]
IC6114  741G373  [DBV-R-PDSO-G5]

### Nets
N$10658: IC5137.3
N$10659: IC5115.3
N$10660: IC5090.3
N$10661: IC5114.3
N$10662: IC5139.2 IC5185.12(F:O)
N$10664: IC5139.3
N$10665: IC5090.1 IC5091.1 IC5114.1 IC5115.1 IC5137.1 IC5138.1 IC5139.1
N$10666: IC5091.3
N$10668: IC5138.3
N$10675: IC5090.2 IC5183.8(D:O)
N$10676: IC5091.2 IC5183.10(E:O)
N$10678: IC5114.2 IC5184.2(A:O)
N$10679: IC5137.2 IC5184.4(B:O)
N$10680: IC5115.2 IC5184.6(C:O)
N$10687: IC5183.9(D:I) IC6110.1(D) IC6111.11(D:O)
N$10689: IC5184.3(B:I) IC5252.4(Q) IC5257.1(D)
N$10692: IC5138.2
N$10694: IC5217.1(A:O) IC5220.5(B:I1)
N$10695: IC5217.2(A:I0) IC5220.1(A:I0)
N$10696: IC5217.3(A:I1) IC5220.9(C:I0)
N$10697: IC5212.4(Q) IC5220.4(B:I0)
N$10698: IC5206.1(D) IC5226.9(A:O)
N$10699: IC5206.2(C)
N$10700: IC5184.5(C:I) IC5206.4(Q) IC5212.1(D)
N$10701: IC5212.2(C)
N$10702: IC5220.8(C:O) IC5226.8(A:I2)
N$10703: IC5220.3(A:O) IC5226.2(A:I1)
N$10704: IC5220.6(B:O) IC5226.1(A:I0)
N$10705: IC5220.10(C:I1) IC6103.10(E:O)
N$10706: IC5220.2(A:I1) IC5810.12(F:O)
N$10707: IC5247.3(A:O) IC5804.5(A:I3)
N$10708: IC5247.6(B:O) IC5804.2(A:I0)
N$10709: IC5242.11(D:O) IC5804.4(A:I2)
N$10710: IC5234.11(D:O) IC5804.3(A:I1)
N$10711: IC5252.2(C)
N$10713: IC5257.2(C)
N$10714: IC5247.4(B:I0) IC5257.4(Q)
N$10715: IC5252.1(D) IC5804.1(A:O)
N$10716: IC5240.6(B:O) IC5247.5(B:I1)
N$10717: IC5234.12(D:I0) IC5240.3(B:I0)
N$10718: IC5240.4(B:I1) IC5242.12(D:I0)
N$10719: IC5240.5(B:I2) IC5247.1(A:I0)
N$10720: IC5234.13(D:I1) IC5810.6(C:O)
N$10721: IC5242.13(D:I1) IC5810.8(D:O)
N$10722: IC5247.2(A:I1)
N$10723: IC5805.1(D)
N$10724: IC5805.2(C)
N$10725: IC5808.2(C)
N$10726: IC5809.2(C)
N$10727: IC5805.4(Q) IC5808.1(D) IC5810.1(A:I)
N$10728: IC5808.4(Q) IC5809.1(D)
N$10729: IC5809.4(Q) IC5815.2(A:I1)
N$10730: IC5810.2(A:O) IC5815.1(A:I0)
N$10731: IC5815.3(A:O) IC5847.1(D)
N$10736: IC5804.13(B:O) IC5968.1(D)
N$10737: IC5196.12(D:I0) IC5203.4(B:I1) IC6114.4(Q)
N$10738: IC5203.5(B:I2) IC5220.12(D:I0)
N$10739: IC5203.3(B:I0) IC5847.4(Q)
N$10740: IC5231.1(A:I0) IC5991.4(Q)
N$10741: IC5185.13(F:I) IC5968.4(Q) IC5991.1(D)
N$10742: IC5968.2(C)
N$10743: IC5847.2(C) IC6114.2(C)
N$10744: IC5991.2(C)
N$10745: IC5804.12(B:I3)
N$10746: IC5196.11(D:O) IC5804.10(B:I1)
N$10747: IC5220.11(D:O) IC5804.11(B:I2)
N$10748: IC5231.3(A:O) IC5804.9(B:I0)
N$10749: IC5203.6(B:O) IC5231.2(A:I1)
N$10750: IC5183.4(B:O) IC5196.13(D:I1)
N$10751: IC5183.6(C:O) IC5220.13(D:I1)
N$10752: IC5184.1(A:I) IC6063.4(Q) IC6075.1(D)
N$10753: IC6023.6(B:I1) IC6043.1(A:I0)
N$10754: IC6023.5(B:I0) IC6043.9(C:I0)
N$10755: IC6023.4(B:O) IC6043.5(B:I1)
N$10756: IC6043.2(A:I1)
N$10757: IC5810.4(B:O) IC6043.10(C:I1)
N$10758: IC6043.4(B:I0) IC6075.4(Q)
N$10759: IC5226.6(B:O) IC6063.1(D)
N$10760: IC5226.4(B:I1) IC6043.8(C:O)
N$10761: IC5226.5(B:I2) IC6043.3(A:O)
N$10762: IC5226.3(B:I0) IC6043.6(B:O)
N$10763: IC6063.2(C)
N$10764: IC6075.2(C)
N$10765: IC6101.1(D) IC6112.1(Q)
N$10766: IC6102.4(Q) IC6112.7(NC)
N$10767: IC5183.11(E:I) IC6101.4(Q) IC6102.1(D)
N$10768: IC6101.2(C)
N$10769: IC6102.2(C)
N$10770: IC5810.10(E:O) IC6112.6(NO)
N$10771: IC5810.11(E:I)
N$10772: IC6103.11(E:I)
N$10773: IC5810.13(F:I) IC6104.13(J)
N$10774: IC6104.12(I7)
N$10775: IC6104.11(I6)
N$10776: IC6104.10(I5)
N$10777: IC6104.9(I4)
N$10778: IC5226.10(C:O) IC6109.1(D)
N$10779: IC6108.12(D:I0) IC6110.4(Q)
N$10780: IC6106.4(B:O) IC6108.13(D:I1)
N$10781: IC6106.6(B:I1) IC6107.9(C:I0)
N$10783: IC5184.12(F:O) IC6108.10(C:I1)
N$10784: IC6106.5(B:I0) IC6108.9(C:I0)
N$10785: IC6107.10(C:I1)
N$10786: IC6109.2(C)
N$10787: IC6110.2(C)
N$10788: IC5226.13(C:I2) IC6107.8(C:O)
N$10789: IC5226.12(C:I1) IC6108.8(C:O)
N$10790: IC5226.11(C:I0) IC6108.11(D:O)
N$10791: IC5089.9(D:I)
N$10792: IC6109.4(Q) IC6111.12(D:I0)
N$10793: IC5089.8(D:O) IC6111.13(D:I1)
N$10794: IC6112.5(A)
N$10795: IC6104.5(I3)
N$10796: IC5183.3(B:I)
N$10797: IC5183.5(C:I)
N$10798: IC6114.1(D)
N$10799: IC5184.13(F:I)
N$10800: IC5810.3(B:I)
N$10801: IC5810.9(D:I)
N$10802: IC5810.5(C:I)
N$10803: IC6104.4(I2)
N$10804: IC6104.3(I1)
N$10805: IC6104.2(I0)
Unconnected: IC5089.1(A:I) IC5089.2(A:O) IC5089.3(B:I) IC5089.4(B:O) IC5089.5(C:I) IC5089.6(C:O) IC5089.10(E:O) IC5089.11(E:I) IC5089.12(F:O) IC5089.13(F:I) IC5090.4(PWR:V-) IC5090.5(PWR:GND) IC5090.6 IC5090.7 IC5090.8 IC5090.9 IC5090.10 IC5090.11 IC5090.12(PWR:VCC) IC5090.13(PWR:V+) IC5090.14 IC5090.15 IC5090.16 IC5091.4(PWR:V-) IC5091.5(PWR:GND) IC5091.6 IC5091.7 IC5091.8 IC5091.9 IC5091.10 IC5091.11 IC5091.12(PWR:VCC) IC5091.13(PWR:V+) IC5091.14 IC5091.15 IC5091.16 IC5114.4(PWR:V-) IC5114.5(PWR:GND) IC5114.6 IC5114.7 IC5114.8 IC5114.9 IC5114.10 IC5114.11 IC5114.12(PWR:VCC) IC5114.13(PWR:V+) IC5114.14 IC5114.15 IC5114.16 IC5115.4(PWR:V-) IC5115.5(PWR:GND) IC5115.6 IC5115.7 IC5115.8 IC5115.9 IC5115.10 IC5115.11 IC5115.12(PWR:VCC) IC5115.13(PWR:V+) IC5115.14 IC5115.15 IC5115.16 IC5137.4(PWR:V-) IC5137.5(PWR:GND) IC5137.6 IC5137.7 IC5137.8 IC5137.9 IC5137.10 IC5137.11 IC5137.12(PWR:VCC) IC5137.13(PWR:V+) IC5137.14 IC5137.15 IC5137.16 IC5138.4(PWR:V-) IC5138.5(PWR:GND) IC5138.6 IC5138.7 IC5138.8 IC5138.9 IC5138.10 IC5138.11 IC5138.12(PWR:VCC) IC5138.13(PWR:V+) IC5138.14 IC5138.15 IC5138.16 IC5139.4(PWR:V-) IC5139.5(PWR:GND) IC5139.6 IC5139.7 IC5139.8 IC5139.9 IC5139.10 IC5139.11 IC5139.12(PWR:VCC) IC5139.13(PWR:V+) IC5139.14 IC5139.15 IC5139.16 IC5183.1(A:I) IC5183.2(A:O) IC5183.12(F:O) IC5183.13(F:I) IC5184.8(D:O) IC5184.9(D:I) IC5184.10(E:O) IC5184.11(E:I) IC5185.1(A:I) IC5185.2(A:O) IC5185.3(B:I) IC5185.4(B:O) IC5185.5(C:I) IC5185.6(C:O) IC5185.8(D:O) IC5185.9(D:I) IC5185.10(E:O) IC5185.11(E:I) IC5196.1(A:I0) IC5196.2(A:I1) IC5196.3(A:O) IC5196.4(B:I0) IC5196.5(B:I1) IC5196.6(B:O) IC5196.8(C:O) IC5196.9(C:I0) IC5196.10(C:I1) IC5203.1(A:I0) IC5203.2(A:I1) IC5203.8(C:O) IC5203.9(C:I0) IC5203.10(C:I1) IC5203.11(C:I2) IC5203.12(A:O) IC5203.13(A:I2) IC5217.4(B:O) IC5217.5(B:I0) IC5217.6(B:I1) IC5217.8(C:I0) IC5217.9(C:I1) IC5217.10(C:O) IC5217.11(D:I0) IC5217.12(D:I1) IC5217.13(D:O) IC5231.4(B:I0) IC5231.5(B:I1) IC5231.6(B:O) IC5231.8(C:O) IC5231.9(C:I0) IC5231.10(C:I1) IC5231.11(D:O) IC5231.12(D:I0) IC5231.13(D:I1) IC5234.1(A:I0) IC5234.2(A:I1) IC5234.3(A:O) IC5234.4(B:I0) IC5234.5(B:I1) IC5234.6(B:O) IC5234.8(C:O) IC5234.9(C:I0) IC5234.10(C:I1) IC5240.1(A:I0) IC5240.2(A:I1) IC5240.8(C:O) IC5240.9(C:I0) IC5240.10(C:I1) IC5240.11(C:I2) IC5240.12(A:O) IC5240.13(A:I2) IC5242.1(A:I0) IC5242.2(A:I1) IC5242.3(A:O) IC5242.4(B:I0) IC5242.5(B:I1) IC5242.6(B:O) IC5242.8(C:O) IC5242.9(C:I0) IC5242.10(C:I1) IC5247.8(C:O) IC5247.9(C:I0) IC5247.10(C:I1) IC5247.11(D:O) IC5247.12(D:I0) IC5247.13(D:I1) IC5815.4(B:I0) IC5815.5(B:I1) IC5815.6(B:O) IC5815.8(C:O) IC5815.9(C:I0) IC5815.10(C:I1) IC5815.11(D:O) IC5815.12(D:I0) IC5815.13(D:I1) IC6023.1(A:O) IC6023.2(A:I0) IC6023.3(A:I1) IC6023.8(C:I0) IC6023.9(C:I1) IC6023.10(C:O) IC6023.11(D:I0) IC6023.12(D:I1) IC6023.13(D:O) IC6043.11(D:O) IC6043.12(D:I0) IC6043.13(D:I1) IC6103.1(A:I) IC6103.2(A:O) IC6103.3(B:I) IC6103.4(B:O) IC6103.5(C:I) IC6103.6(C:O) IC6103.8(D:O) IC6103.9(D:I) IC6103.12(F:O) IC6103.13(F:I) IC6106.1(A:O) IC6106.2(A:I0) IC6106.3(A:I1) IC6106.8(C:I0) IC6106.9(C:I1) IC6106.10(C:O) IC6106.11(D:I0) IC6106.12(D:I1) IC6106.13(D:O) IC6107.1(A:I0) IC6107.2(A:I1) IC6107.3(A:O) IC6107.4(B:I0) IC6107.5(B:I1) IC6107.6(B:O) IC6107.11(D:O) IC6107.12(D:I0) IC6107.13(D:I1) IC6108.1(A:I0) IC6108.2(A:I1) IC6108.3(A:O) IC6108.4(B:I0) IC6108.5(B:I1) IC6108.6(B:O) IC6111.1(A:I0) IC6111.2(A:I1) IC6111.3(A:O) IC6111.4(B:I0) IC6111.5(B:I1) IC6111.6(B:O) IC6111.8(C:O) IC6111.9(C:I0) IC6111.10(C:I1)

### Notes on the sheet
- PHI2
- Flags | Z FLAG
- P/DB
- z_latch2
- /C_OUT
- DB0
- DB0
- DB1
- z_latch1
- DB2 | DBZ/Z | /Z_OUT | /Z_OUT
- DB1
- DB3 | DBZ | /DBZ
- DB4
- DB5 | /I_OUT
- DB/P | DB2
- DB6 | PHI1
- /DB1
- DB7 | DB1
- /D_OUT
- DB3
- PHI2
- B_OUT | DB4
- N FLAG
- DB/N
- n_latch2
- n_latch1 | /V_OUT
- /N_OUT | DB6
- /DB7
- DB7
- /N_OUT
- DB7
- PHI1
- PHI2
- C FLAG
- c_latch2
- ACR/C
- /ACR
- ACR
- c_latch1
- /C_OUT
- DB/C
- /DB0
- DB0
- I5/C | PHI1
- /IR5
- PHI2
- D FLAG
- d_latch2
- d_latch1
- DB/P | /D_OUT
- /DB3
- DB3
- IR5/D
- PHI1
- /IR5
- PHI2
- I FLAG
- i_latch2
- i_latch1 | /I_OUT
- DB/P
- /DB2
- DB2
- IR5/I
- PHI1
- /IR5
- BRK6E
- last cycle of BRK/int sets I Flag
- falling edge detector
- V FLAG
- if V flag is not modified
  by ALU operation or by writing P,
  a falling edge on CPS will set V flag.
- PHI2
- PHI2
- PHI2
- /C_OUT
- v_latch2
- so_latch1 | so_latch3 | SO_EDGE | 1/V
- SO | /Z_OUT
- PAD | vset_latch
- so_latch2 | /I_OUT
- /D_OUT
- PHI1 | PHI1 | AVR/V | v_latch1
- /V_OUT
- 112 | /V_OUT
- avr_latch
- /N_OUT
- PHI1
- AVR#
- AVR
- PHI2
- 0/V | PHI1
- DB/V
- SO
- DB6#
- ttl:127:T1.ADC_SBC_
- DB6
- clear V flag
- SO_EDGE
- https://github.com/emu-russia/breaks/blob/master/BreakingNESWiki_DeepL/6502/flags.md
  15:https://github.com/emu-russia/breaks/blob/master/BreakingNESWiki/imgstore/logisim/flags_logisim.jpg

## Sheet 17 of 29
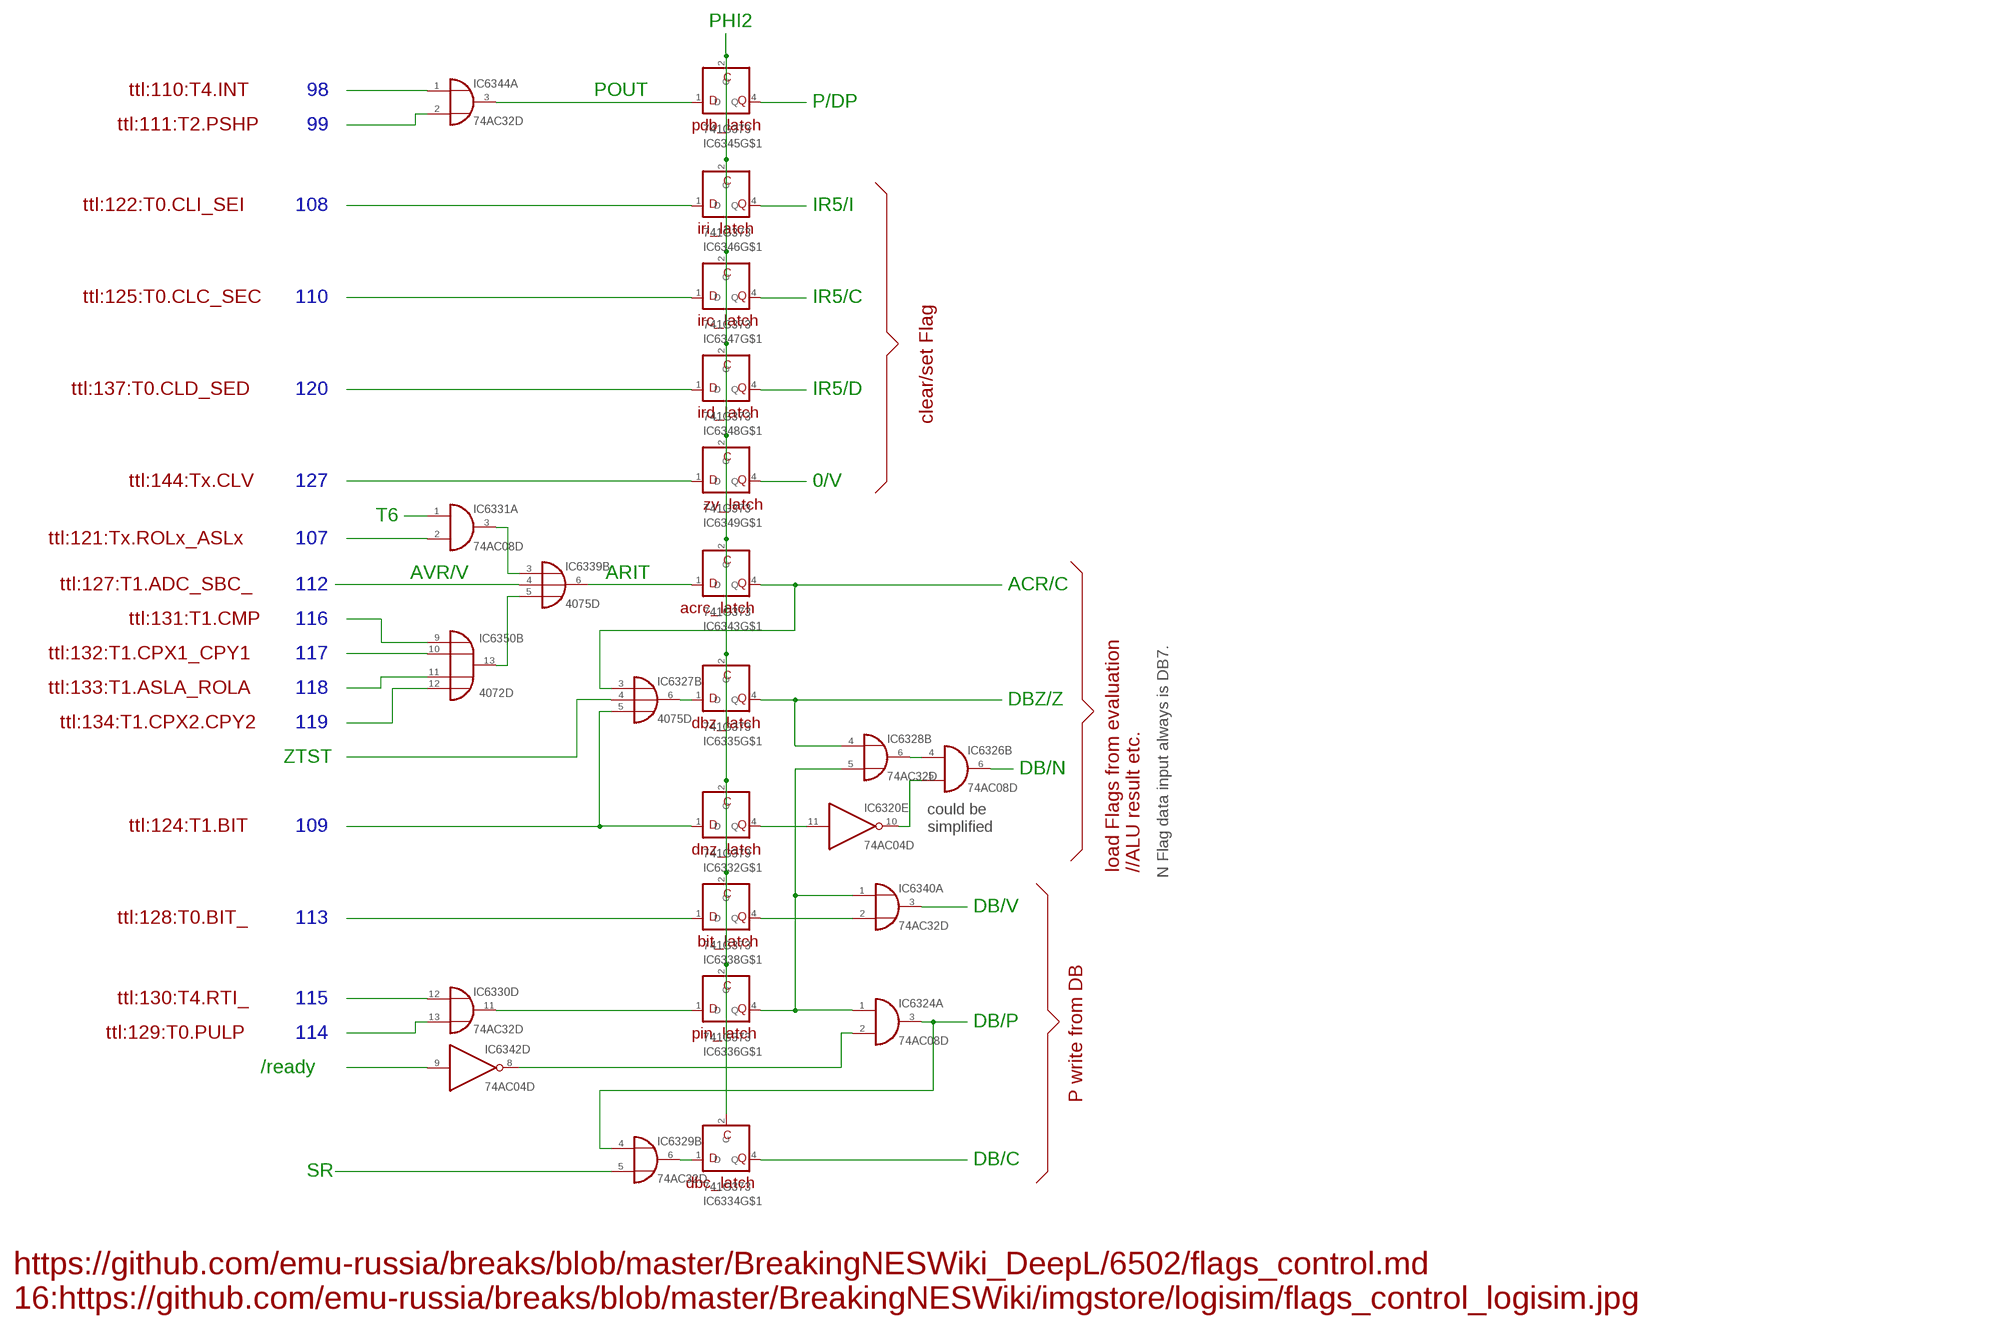
[diagram p21: schematic, sheet 17]

### Parts
IC6320  74AC04D  [SO14]
IC6324  74AC08D  [SO14]
IC6326  74AC08D  [SO14]
IC6327  4075D  [SO14]
IC6328  74AC32D  [SO14]
IC6329  74AC32D  [SO14]
IC6330  74AC32D  [SO14]
IC6331  74AC08D  [SO14]
IC6332  741G373  [DBV-R-PDSO-G5]
IC6334  741G373  [DBV-R-PDSO-G5]
IC6335  741G373  [DBV-R-PDSO-G5]
IC6336  741G373  [DBV-R-PDSO-G5]
IC6338  741G373  [DBV-R-PDSO-G5]
IC6339  4075D  [SO14]
IC6340  74AC32D  [SO14]
IC6342  74AC04D  [SO14]
IC6343  741G373  [DBV-R-PDSO-G5]
IC6344  74AC32D  [SO14]
IC6345  741G373  [DBV-R-PDSO-G5]
IC6346  741G373  [DBV-R-PDSO-G5]
IC6347  741G373  [DBV-R-PDSO-G5]
IC6348  741G373  [DBV-R-PDSO-G5]
IC6349  741G373  [DBV-R-PDSO-G5]
IC6350  4072D  [SO14]

### Nets
N$11523: IC6331.2(A:I1)
N$11524: IC6330.13(D:I1)
N$11525: IC6330.12(D:I0)
N$11526: IC6350.11(B:I2)
N$11527: IC6350.9(B:I0)
N$11528: IC6338.1(D)
N$11530: IC6327.5(B:I2) IC6332.1(D)
N$11531: IC6330.11(D:O) IC6336.1(D)
N$11532: IC6324.3(A:O) IC6329.4(B:I0)
N$11535: IC6340.3(A:O)
N$11536: IC6338.4(Q) IC6340.2(A:I1)
N$11537: IC6327.3(B:I0) IC6343.4(Q)
N$11538: IC6320.10(E:O) IC6326.5(B:I1)
N$11539: IC6334.4(Q)
N$11540: IC6329.6(B:O) IC6334.1(D)
N$11541: IC6327.6(B:O) IC6335.1(D)
N$11542: IC6331.3(A:O) IC6339.3(B:I0)
N$11543: IC6324.1(A:I0) IC6328.5(B:I1) IC6336.4(Q) IC6340.1(A:I0)
N$11544: IC6342.9(D:I)
N$11545: IC6324.2(A:I1) IC6342.8(D:O)
N$11546: IC6328.4(B:I0) IC6335.4(Q)
N$11547: IC6320.11(E:I) IC6332.4(Q)
N$11548: IC6326.4(B:I0) IC6328.6(B:O)
N$11549: IC6327.4(B:I1)
N$11550: IC6339.6(B:O) IC6343.1(D)
N$11551: IC6344.2(A:I1)
N$11552: IC6344.1(A:I0)
N$11553: IC6344.3(A:O) IC6345.1(D)
N$11554: IC6332.2(C) IC6334.2(C) IC6335.2(C) IC6336.2(C) IC6338.2(C) IC6343.2(C) IC6345.2(C) IC6346.2(C) IC6347.2(C) IC6348.2(C) IC6349.2(C)
N$11555: IC6345.4(Q)
N$11556: IC6346.4(Q)
N$11557: IC6346.1(D)
N$11559: IC6347.4(Q)
N$11560: IC6347.1(D)
N$11561: IC6348.4(Q)
N$11562: IC6348.1(D)
N$11563: IC6349.4(Q)
N$11565: IC6349.1(D)
N$11566: IC6331.1(A:I0)
N$11567: IC6350.12(B:I3)
N$11569: IC6350.10(B:I1)
N$11570: IC6339.5(B:I2) IC6350.13(B:O)
N$11571: IC6339.4(B:I1)
N$11572: IC6326.6(B:O)
N$11573: IC6329.5(B:I1)
Unconnected: IC6320.1(A:I) IC6320.2(A:O) IC6320.3(B:I) IC6320.4(B:O) IC6320.5(C:I) IC6320.6(C:O) IC6320.8(D:O) IC6320.9(D:I) IC6320.12(F:O) IC6320.13(F:I) IC6324.4(B:I0) IC6324.5(B:I1) IC6324.6(B:O) IC6324.8(C:O) IC6324.9(C:I0) IC6324.10(C:I1) IC6324.11(D:O) IC6324.12(D:I0) IC6324.13(D:I1) IC6326.1(A:I0) IC6326.2(A:I1) IC6326.3(A:O) IC6326.8(C:O) IC6326.9(C:I0) IC6326.10(C:I1) IC6326.11(D:O) IC6326.12(D:I0) IC6326.13(D:I1) IC6327.1(A:I0) IC6327.2(A:I1) IC6327.8(A:I2) IC6327.9(A:O) IC6327.10(C:O) IC6327.11(C:I0) IC6327.12(C:I1) IC6327.13(C:I2) IC6328.1(A:I0) IC6328.2(A:I1) IC6328.3(A:O) IC6328.8(C:O) IC6328.9(C:I0) IC6328.10(C:I1) IC6328.11(D:O) IC6328.12(D:I0) IC6328.13(D:I1) IC6329.1(A:I0) IC6329.2(A:I1) IC6329.3(A:O) IC6329.8(C:O) IC6329.9(C:I0) IC6329.10(C:I1) IC6329.11(D:O) IC6329.12(D:I0) IC6329.13(D:I1) IC6330.1(A:I0) IC6330.2(A:I1) IC6330.3(A:O) IC6330.4(B:I0) IC6330.5(B:I1) IC6330.6(B:O) IC6330.8(C:O) IC6330.9(C:I0) IC6330.10(C:I1) IC6331.4(B:I0) IC6331.5(B:I1) IC6331.6(B:O) IC6331.8(C:O) IC6331.9(C:I0) IC6331.10(C:I1) IC6331.11(D:O) IC6331.12(D:I0) IC6331.13(D:I1) IC6339.1(A:I0) IC6339.2(A:I1) IC6339.8(A:I2) IC6339.9(A:O) IC6339.10(C:O) IC6339.11(C:I0) IC6339.12(C:I1) IC6339.13(C:I2) IC6340.4(B:I0) IC6340.5(B:I1) IC6340.6(B:O) IC6340.8(C:O) IC6340.9(C:I0) IC6340.10(C:I1) IC6340.11(D:O) IC6340.12(D:I0) IC6340.13(D:I1) IC6342.1(A:I) IC6342.2(A:O) IC6342.3(B:I) IC6342.4(B:O) IC6342.5(C:I) IC6342.6(C:O) IC6342.10(E:O) IC6342.11(E:I) IC6342.12(F:O) IC6342.13(F:I) IC6344.4(B:I0) IC6344.5(B:I1) IC6344.6(B:O) IC6344.8(C:O) IC6344.9(C:I0) IC6344.10(C:I1) IC6344.11(D:O) IC6344.12(D:I0) IC6344.13(D:I1) IC6350.1(A:O) IC6350.2(A:I0) IC6350.3(A:I1) IC6350.4(A:I2) IC6350.5(A:I3)

### Notes on the sheet
- PHI2
- ttl:110:T4.INT | 98 | POUT
- P/DP
- ttl:111:T2.PSHP | 99 | pdb_latch
- ttl:122:T0.CLI_SEI | 108 | IR5/I
- iri_latch
- ttl:125:T0.CLC_SEC | 110 | IR5/C
- irc_latch
- ttl:137:T0.CLD_SED | 120 | IR5/D
- ird_latch
- clear/set Flag
- ttl:144:Tx.CLV | 127 | 0/V
- zv_latch
- T6
- ttl:121:Tx.ROLx_ASLx | 107
- AVR/V | ARIT
- ttl:127:T1.ADC_SBC_ | 112 | ACR/C
- acrc_latch
- ttl:131:T1.CMP | 116
- ttl:132:T1.CPX1_CPY1 | 117
- ttl:133:T1.ASLA_ROLA | 118
- DBZ/Z
- ttl:134:T1.CPX2.CPY2 | 119 | dbz_latch
- ZTST
- DB/N
- ttl:124:T1.BIT | 109
- could be
  simplified
- dnz_latch
- load Flags from evaluation
  //ALU result etc.
- N Flag data input always is DB7.
- DB/V
- ttl:128:T0.BIT_ | 113
- bit_latch
- ttl:130:T4.RTI_ | 115
- DB/P
- ttl:129:T0.PULP | 114 | pin_latch
- /ready
- P write from DB
- DB/C
- SR
- dbc_latch
- https://github.com/emu-russia/breaks/blob/master/BreakingNESWiki_DeepL/6502/flags_control.md
  16:https://github.com/emu-russia/breaks/blob/master/BreakingNESWiki/imgstore/logisim/flags_control_logisim.jpg

## Sheet 18 of 29
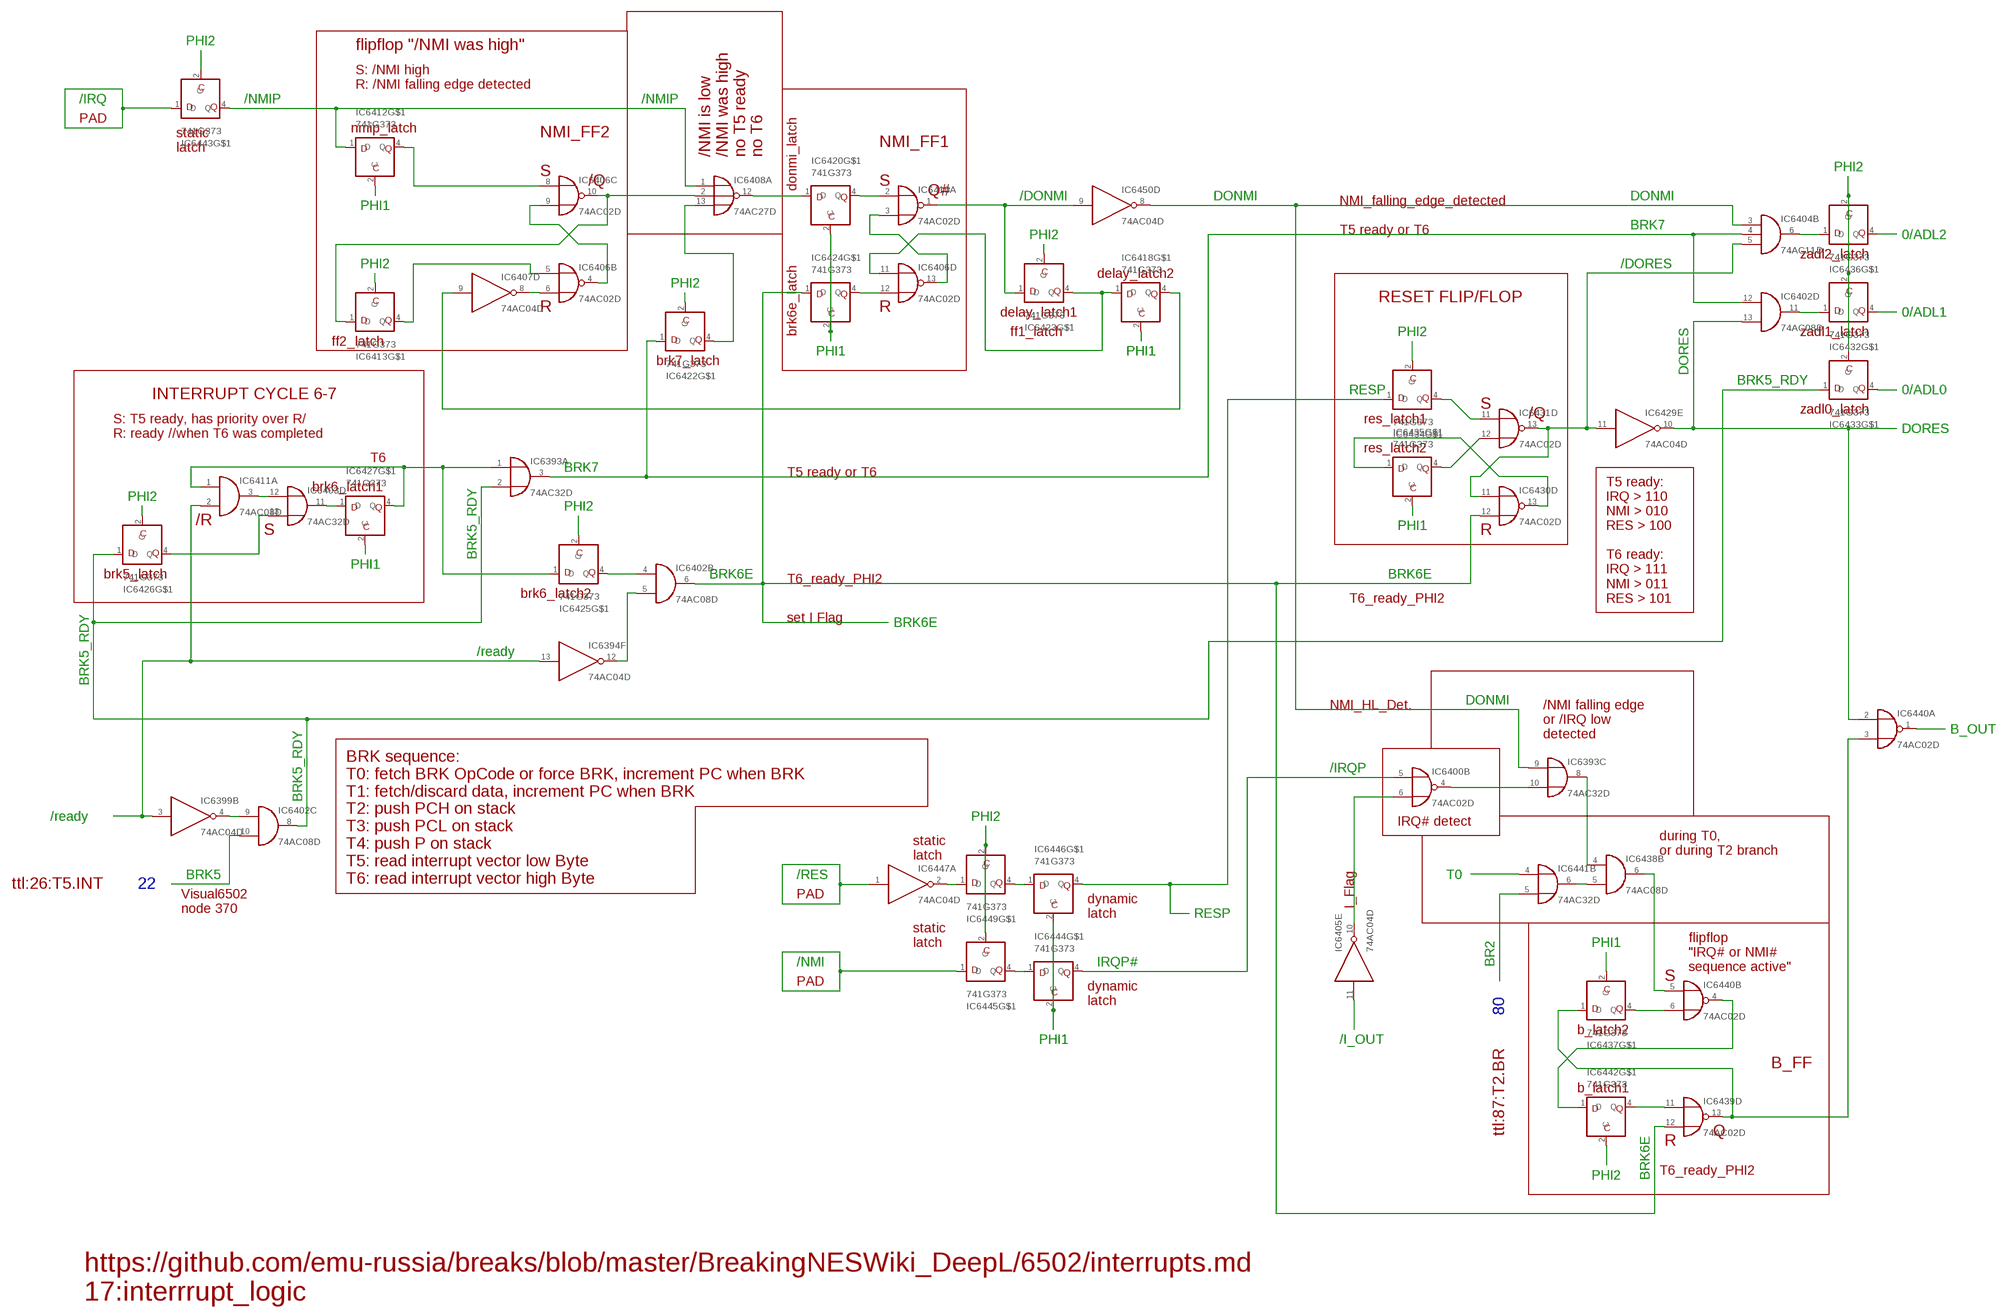
[diagram p22: schematic, sheet 18]

### Parts
IC6393  74AC32D  [SO14]
IC6394  74AC04D  [SO14]
IC6399  74AC04D  [SO14]
IC6400  74AC02D  [SO14]
IC6402  74AC08D  [SO14]
IC6403  74AC32D  [SO14]
IC6404  74AC11D  [SO14]
IC6405  74AC04D  [SO14]
IC6406  74AC02D  [SO14]
IC6407  74AC04D  [SO14]
IC6408  74AC27D  [SO14]
IC6410  74AC02D  [SO14]
IC6411  74AC08D  [SO14]
IC6412  741G373  [DBV-R-PDSO-G5]
IC6413  741G373  [DBV-R-PDSO-G5]
IC6418  741G373  [DBV-R-PDSO-G5]
IC6420  741G373  [DBV-R-PDSO-G5]
IC6422  741G373  [DBV-R-PDSO-G5]
IC6423  741G373  [DBV-R-PDSO-G5]
IC6424  741G373  [DBV-R-PDSO-G5]
IC6425  741G373  [DBV-R-PDSO-G5]
IC6426  741G373  [DBV-R-PDSO-G5]
IC6427  741G373  [DBV-R-PDSO-G5]
IC6429  74AC04D  [SO14]
IC6430  74AC02D  [SO14]
IC6431  74AC02D  [SO14]
IC6432  741G373  [DBV-R-PDSO-G5]
IC6433  741G373  [DBV-R-PDSO-G5]
IC6434  741G373  [DBV-R-PDSO-G5]
IC6435  741G373  [DBV-R-PDSO-G5]
IC6436  741G373  [DBV-R-PDSO-G5]
IC6437  741G373  [DBV-R-PDSO-G5]
IC6438  74AC08D  [SO14]
IC6439  74AC02D  [SO14]
IC6440  74AC02D  [SO14]
IC6441  74AC32D  [SO14]
IC6442  741G373  [DBV-R-PDSO-G5]
IC6443  741G373  [DBV-R-PDSO-G5]
IC6444  741G373  [DBV-R-PDSO-G5]
IC6445  741G373  [DBV-R-PDSO-G5]
IC6446  741G373  [DBV-R-PDSO-G5]
IC6447  74AC04D  [SO14]
IC6449  741G373  [DBV-R-PDSO-G5]
IC6450  74AC04D  [SO14]

### Nets
N$11629: IC6404.5(B:I2) IC6429.11(E:I) IC6430.11(D:I0) IC6431.13(D:O)
N$11630: IC6402.6(B:O) IC6424.1(D) IC6430.12(D:I1) IC6439.12(D:I1)
N$11631: IC6406.8(C:I0) IC6412.4(Q)
N$11632: IC6412.2(C)
N$11633: IC6408.12(A:O) IC6420.1(D)
N$11634: IC6413.2(C)
N$11635: IC6408.13(A:I2) IC6422.4(Q)
N$11636: IC6406.10(C:O) IC6408.2(A:I1) IC6413.1(D)
N$11637: IC6406.5(B:I0) IC6413.4(Q)
N$11638: IC6406.4(B:O) IC6406.9(C:I1)
N$11639: IC6418.2(C)
N$11640: IC6406.6(B:I1) IC6407.8(D:O)
N$11641: IC6410.2(A:I0) IC6420.4(Q)
N$11642: IC6423.2(C)
N$11643: IC6406.11(D:I0) IC6418.1(D) IC6423.4(Q)
N$11644: IC6406.12(D:I1) IC6424.4(Q)
N$11645: IC6406.13(D:O) IC6410.3(A:I1)
N$11646: IC6394.13(F:I) IC6399.3(B:I) IC6411.2(A:I1)
N$11647: IC6402.4(B:I0) IC6425.4(Q)
N$11648: IC6425.2(C)
N$11649: IC6427.2(C)
N$11650: IC6403.11(D:O) IC6427.1(D)
N$11651: IC6426.2(C)
N$11652: IC6403.13(D:I1) IC6426.4(Q)
N$11653: IC6393.1(A:I0) IC6411.1(A:I0) IC6425.1(D) IC6427.4(Q)
N$11654: IC6403.12(D:I0) IC6411.3(A:O)
N$11655: IC6420.2(C) IC6424.2(C)
N$11656: IC6433.4(Q)
N$11657: IC6432.4(Q)
N$11658: IC6402.11(D:O) IC6432.1(D)
N$11659: IC6436.4(Q)
N$11660: IC6432.2(C) IC6433.2(C) IC6436.2(C)
N$11661: IC6393.2(A:I1) IC6402.8(C:O) IC6426.1(D) IC6433.1(D)
N$11662: IC6404.6(B:O) IC6436.1(D)
N$11663: IC6430.13(D:O) IC6435.1(D)
N$11664: IC6435.2(C)
N$11665: IC6431.12(D:I1) IC6435.4(Q)
N$11666: IC6434.2(C)
N$11667: IC6431.11(D:I0) IC6434.4(Q)
N$11668: IC6399.4(B:O) IC6402.9(C:I0)
N$11669: IC6393.8(C:O) IC6438.4(B:I0)
N$11670: IC6393.9(C:I0) IC6404.3(B:I0) IC6450.8(D:O)
N$11671: IC6441.4(B:I0)
N$11672: IC6438.6(B:O) IC6440.5(B:I0)
N$11673: IC6437.2(C)
N$11674: IC6437.4(Q) IC6440.6(B:I1)
N$11675: IC6442.2(C)
N$11676: IC6439.11(D:I0) IC6442.4(Q)
N$11677: IC6440.1(A:O)
N$11678: IC6437.1(D) IC6439.13(D:O) IC6440.3(A:I1)
N$11679: IC6393.10(C:I1) IC6400.4(B:O)
N$11680: IC6440.4(B:O) IC6442.1(D)
N$11681: IC6438.5(B:I1) IC6441.6(B:O)
N$11682: IC6408.1(A:I0) IC6412.1(D) IC6443.4(Q)
N$11683: IC6443.1(D)
N$11684: IC6443.2(C)
N$11685: IC6444.2(C) IC6446.2(C)
N$11686: IC6400.5(B:I0) IC6444.4(Q)
N$11687: IC6445.1(D)
N$11688: IC6445.2(C) IC6449.2(C)
N$11689: IC6444.1(D) IC6445.4(Q)
N$11690: IC6434.1(D) IC6446.4(Q)
N$11691: IC6447.1(A:I)
N$11692: IC6446.1(D) IC6449.4(Q)
N$11695: IC6447.2(A:O) IC6449.1(D)
N$11696: IC6400.6(B:I1) IC6405.10(E:O)
N$11697: IC6402.10(C:I1)
N$11698: IC6441.5(B:I1)
N$11699: IC6394.12(F:O) IC6402.5(B:I1)
N$11700: IC6393.3(A:O) IC6402.12(D:I0) IC6404.4(B:I1) IC6422.1(D)
N$11701: IC6407.9(D:I) IC6418.4(Q)
N$11702: IC6402.13(D:I1) IC6429.10(E:O) IC6440.2(A:I0)
N$11703: IC6405.11(E:I)
N$11704: IC6410.1(A:O) IC6423.1(D) IC6450.9(D:I)
N$11705: IC6422.2(C)
Unconnected: IC6393.4(B:I0) IC6393.5(B:I1) IC6393.6(B:O) IC6393.11(D:O) IC6393.12(D:I0) IC6393.13(D:I1) IC6394.1(A:I) IC6394.2(A:O) IC6394.3(B:I) IC6394.4(B:O) IC6394.5(C:I) IC6394.6(C:O) IC6394.8(D:O) IC6394.9(D:I) IC6394.10(E:O) IC6394.11(E:I) IC6399.1(A:I) IC6399.2(A:O) IC6399.5(C:I) IC6399.6(C:O) IC6399.8(D:O) IC6399.9(D:I) IC6399.10(E:O) IC6399.11(E:I) IC6399.12(F:O) IC6399.13(F:I) IC6400.1(A:O) IC6400.2(A:I0) IC6400.3(A:I1) IC6400.8(C:I0) IC6400.9(C:I1) IC6400.10(C:O) IC6400.11(D:I0) IC6400.12(D:I1) IC6400.13(D:O) IC6402.1(A:I0) IC6402.2(A:I1) IC6402.3(A:O) IC6403.1(A:I0) IC6403.2(A:I1) IC6403.3(A:O) IC6403.4(B:I0) IC6403.5(B:I1) IC6403.6(B:O) IC6403.8(C:O) IC6403.9(C:I0) IC6403.10(C:I1) IC6404.1(A:I0) IC6404.2(A:I1) IC6404.8(C:O) IC6404.9(C:I0) IC6404.10(C:I1) IC6404.11(C:I2) IC6404.12(A:O) IC6404.13(A:I2) IC6405.1(A:I) IC6405.2(A:O) IC6405.3(B:I) IC6405.4(B:O) IC6405.5(C:I) IC6405.6(C:O) IC6405.8(D:O) IC6405.9(D:I) IC6405.12(F:O) IC6405.13(F:I) IC6406.1(A:O) IC6406.2(A:I0) IC6406.3(A:I1) IC6407.1(A:I) IC6407.2(A:O) IC6407.3(B:I) IC6407.4(B:O) IC6407.5(C:I) IC6407.6(C:O) IC6407.10(E:O) IC6407.11(E:I) IC6407.12(F:O) IC6407.13(F:I) IC6408.3(B:I0) IC6408.4(B:I1) IC6408.5(B:I2) IC6408.6(B:O) IC6408.8(C:O) IC6408.9(C:I0) IC6408.10(C:I1) IC6408.11(C:I2) IC6410.4(B:O) IC6410.5(B:I0) IC6410.6(B:I1) IC6410.8(C:I0) IC6410.9(C:I1) IC6410.10(C:O) IC6410.11(D:I0) IC6410.12(D:I1) IC6410.13(D:O) IC6411.4(B:I0) IC6411.5(B:I1) IC6411.6(B:O) IC6411.8(C:O) IC6411.9(C:I0) IC6411.10(C:I1) IC6411.11(D:O) IC6411.12(D:I0) IC6411.13(D:I1) IC6429.1(A:I) IC6429.2(A:O) IC6429.3(B:I) IC6429.4(B:O) IC6429.5(C:I) IC6429.6(C:O) IC6429.8(D:O) IC6429.9(D:I) IC6429.12(F:O) IC6429.13(F:I) IC6430.1(A:O) IC6430.2(A:I0) IC6430.3(A:I1) IC6430.4(B:O) IC6430.5(B:I0) IC6430.6(B:I1) IC6430.8(C:I0) IC6430.9(C:I1) IC6430.10(C:O) IC6431.1(A:O) IC6431.2(A:I0) IC6431.3(A:I1) IC6431.4(B:O) IC6431.5(B:I0) IC6431.6(B:I1) IC6431.8(C:I0) IC6431.9(C:I1) IC6431.10(C:O) IC6438.1(A:I0) IC6438.2(A:I1) IC6438.3(A:O) IC6438.8(C:O) IC6438.9(C:I0) IC6438.10(C:I1) IC6438.11(D:O) IC6438.12(D:I0) IC6438.13(D:I1) IC6439.1(A:O) IC6439.2(A:I0) IC6439.3(A:I1) IC6439.4(B:O) IC6439.5(B:I0) IC6439.6(B:I1) IC6439.8(C:I0) IC6439.9(C:I1) IC6439.10(C:O) IC6440.8(C:I0) IC6440.9(C:I1) IC6440.10(C:O) IC6440.11(D:I0) IC6440.12(D:I1) IC6440.13(D:O) IC6441.1(A:I0) IC6441.2(A:I1) IC6441.3(A:O) IC6441.8(C:O) IC6441.9(C:I0) IC6441.10(C:I1) IC6441.11(D:O) IC6441.12(D:I0) IC6441.13(D:I1) IC6447.3(B:I) IC6447.4(B:O) IC6447.5(C:I) IC6447.6(C:O) IC6447.8(D:O) IC6447.9(D:I) IC6447.10(E:O) IC6447.11(E:I) IC6447.12(F:O) IC6447.13(F:I) IC6450.1(A:I) IC6450.2(A:O) IC6450.3(B:I) IC6450.4(B:O) IC6450.5(C:I) IC6450.6(C:O) IC6450.10(E:O) IC6450.11(E:I) IC6450.12(F:O) IC6450.13(F:I)

### Notes on the sheet
- PHI2
- flipflop "/NMI was high"
- S: /NMI high
  R: /NMI falling edge detected
- /IRQ | /NMIP | /NMIP
- PAD
- nmip_latch
- NMI_FF2
- NMI_FF1
- static
  latch
- /NMI is low
  /NMI was high
  no T5 ready
  no T6
- PHI2
- S
- /Q | S
- donmi_latch
- Q#
- /DONMI | DONMI | DONMI
- NMI_falling_edge_detected
- PHI1
- BRK7
- T5 ready or T6
- PHI2 | 0/ADL2
- zadl2_latch
- PHI2 | /DORES
- delay_latch2
- PHI2
- RESET FLIP/FLOP
- R | R
- delay_latch1 | 0/ADL1
- brk6e_latch | ff1_latch | PHI2 | zadl1_latch
- ff2_latch
- PHI1 | PHI1
- brk7_latch
- DORES
- BRK5_RDY
- RESP | 0/ADL0
- INTERRUPT CYCLE 6-7
- S
- zadl0_latch
- /Q
- res_latch1
- DORES
- S: T5 ready, has priority over R/
  R: ready //when T6 was completed
- res_latch2
- T6
- BRK7
- T5 ready or T6
- brk6_latch1
- PHI2
- PHI2
- /R
- PHI1
- S | R
- BRK5_RDY
- PHI1
- brk5_latch | BRK6E | BRK6E
- T6_ready_PHI2
- brk6_latch2
- T6_ready_PHI2
- T5 ready:
  IRQ > 110
  NMI > 010
  RES > 100
  
  T6 ready:
  IRQ > 111
  NMI > 011
  RES > 101
- set I Flag
- BRK6E
- /ready
- BRK5_RDY
- DONMI
- NMI_HL_Det.
- B_OUT
- /NMI falling edge
  or /IRQ low
  detected
- /IRQP
- BRK5_RDY
- /ready | PHI2
- IRQ# detect
- during T0,
  or during T2 branch
- static
  latch
- BRK5 | /RES | T0
- BRK sequence:
  T0: fetch BRK OpCode or force BRK, increment PC when BRK
  T1: fetch/discard data, increment PC when BRK
  T2: push PCH on stack
  T3: push PCL on stack
  T4: push P on stack
  T5: read interrupt vector low Byte
  T6: read interrupt vector high Byte
- ttl:26:T5.INT | 22
- PAD
- I_Flag
- Visual6502
  node 370
- dynamic
  latch
- RESP
- static
  latch
- PHI1
- /NMI | IRQP# | BR2
- flipflop
  "IRQ# or NMI#
  sequence active"
- S
- PAD
- dynamic
  latch
- 80
- b_latch2
- PHI1 | /I_OUT
- B_FF
- b_latch1
- ttl:87:T2.BR | Q
- R
- T6_ready_PHI2
- PHI2 | BRK6E
- https://github.com/emu-russia/breaks/blob/master/BreakingNESWiki_DeepL/6502/interrupts.md
  17:interrrupt_logic

## Sheet 19 of 29
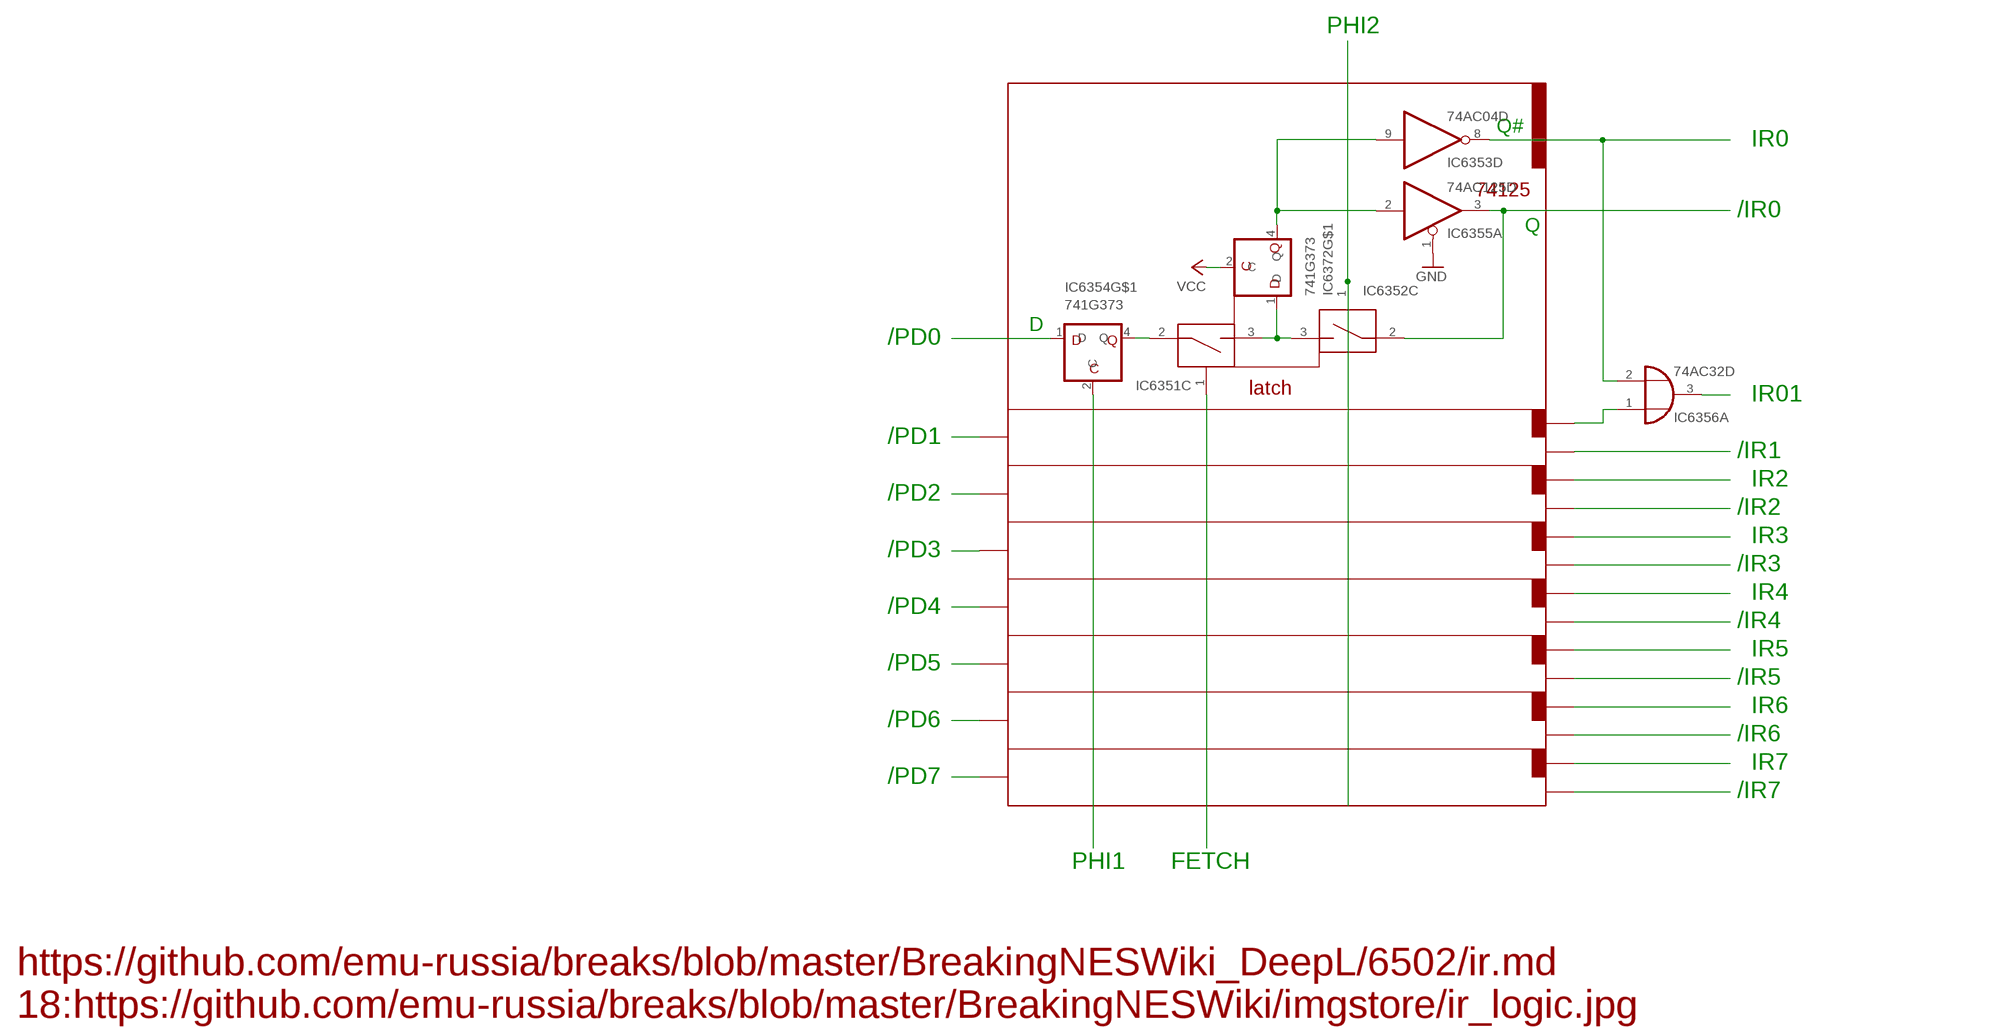
[diagram p23: schematic, sheet 19]

### Parts
IC6351  MAX4613SO16  [SO16]
IC6352  MAX4613SO16  [SO16]
IC6353  74AC04D  [SO14]
IC6354  741G373  [DBV-R-PDSO-G5]
IC6355  74AC125D  [SO14]
IC6356  74AC32D  [SO14]
IC6372  741G373  [DBV-R-PDSO-G5]

### Nets
GND: IC6355.1(A:OE) ; also sheet 1,2,3,4,9,10,11,12,13,14,20,21,22,23
N$11585: IC6351.2 IC6354.4(Q)
N$11586: IC6353.9(D:I) IC6355.2(A:I) IC6372.4(Q)
N$11587: IC6356.1(A:I0)
N$11588: IC6354.2(C)
N$11589: IC6352.1
N$11590: IC6356.3(A:O)
N$11591: IC6353.8(D:O) IC6356.2(A:I1)
N$11592: IC6352.2 IC6355.3(A:O)
N$11606: IC6351.1
N$11612: IC6354.1(D)
N$11616: IC6351.3 IC6352.3 IC6372.1(D)
VCC: IC6372.2(C) ; also sheet 1,2,3,4,9,11,12,13,20,21,22,23,26
Unconnected: IC6351.4(PWR:V-) IC6351.5(PWR:GND) IC6351.6 IC6351.7 IC6351.8 IC6351.9 IC6351.10 IC6351.11 IC6351.12(PWR:VCC) IC6351.13(PWR:V+) IC6351.14 IC6351.15 IC6351.16 IC6352.4(PWR:V-) IC6352.5(PWR:GND) IC6352.6 IC6352.7 IC6352.8 IC6352.9 IC6352.10 IC6352.11 IC6352.12(PWR:VCC) IC6352.13(PWR:V+) IC6352.14 IC6352.15 IC6352.16 IC6353.1(A:I) IC6353.2(A:O) IC6353.3(B:I) IC6353.4(B:O) IC6353.5(C:I) IC6353.6(C:O) IC6353.10(E:O) IC6353.11(E:I) IC6353.12(F:O) IC6353.13(F:I) IC6355.4(B:OE) IC6355.5(B:I) IC6355.6(B:O) IC6355.8(C:O) IC6355.9(C:I) IC6355.10(C:OE) IC6355.11(D:O) IC6355.12(D:I) IC6355.13(D:OE) IC6356.4(B:I0) IC6356.5(B:I1) IC6356.6(B:O) IC6356.8(C:O) IC6356.9(C:I0) IC6356.10(C:I1) IC6356.11(D:O) IC6356.12(D:I0) IC6356.13(D:I1)

### Notes on the sheet
- PHI2
- Q#
- IR0
- 74125
- /IR0
- Q
- D
- /PD0
- latch
- IR01
- /PD1
- /IR1
- IR2
- /PD2
- /IR2
- IR3
- /PD3
- /IR3
- IR4
- /PD4
- /IR4
- IR5
- /PD5
- /IR5
- IR6
- /PD6
- /IR6
- IR7
- /PD7
- /IR7
- PHI1 | FETCH
- https://github.com/emu-russia/breaks/blob/master/BreakingNESWiki_DeepL/6502/ir.md
  18:https://github.com/emu-russia/breaks/blob/master/BreakingNESWiki/imgstore/ir_logic.jpg